# Altium project STPMotorControl_1.PrjPcb (part 1 of 2)
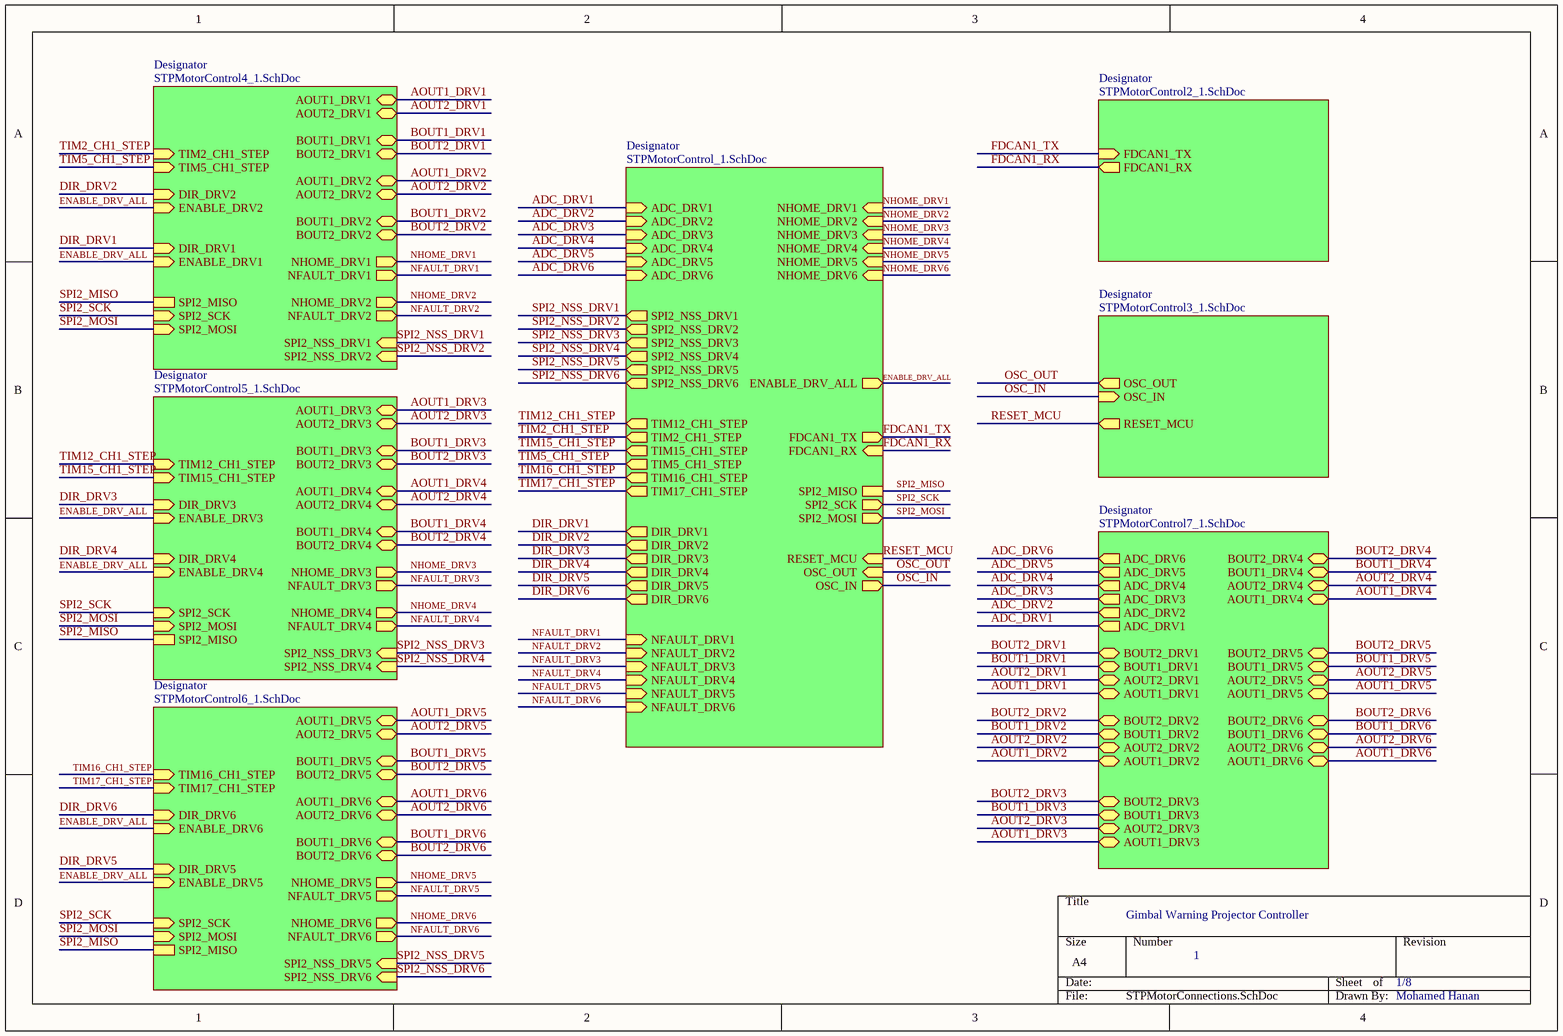
[diagram p0: STPMotorConnections.SchDoc]
8 sheets, 149 parts. Net scope: hierarchical (ports join the sheet entries above them; power ports are global).
Board file: STPMotorControl_1.PcbDoc
Sheets:
  STPMotorConnections.SchDoc
    Designator = STPMotorControl_1.SchDoc
    Designator = STPMotorControl2_1.SchDoc
    Designator = STPMotorControl3_1.SchDoc
    Designator = STPMotorControl4_1.SchDoc
    Designator = STPMotorControl5_1.SchDoc
    Designator = STPMotorControl6_1.SchDoc
    Designator = STPMotorControl7_1.SchDoc

## Sheet STPMotorConnections.SchDoc
size A4; SheetNumber: 1; SheetTotal: 8

### Sub-sheets
Designator = STPMotorControl_1.SchDoc: TIM12_CH1_STEP (out), TIM2_CH1_STEP (out), TIM15_CH1_STEP (out), TIM5_CH1_STEP (out), TIM16_CH1_STEP (out), TIM17_CH1_STEP (out), DIR_DRV1 (out), DIR_DRV2 (out), DIR_DRV3 (out), DIR_DRV4 (out), DIR_DRV5 (out), DIR_DRV6 (out), NFAULT_DRV1 (in), NFAULT_DRV2 (in), NFAULT_DRV3 (in), NFAULT_DRV4 (in), NFAULT_DRV5 (in), NFAULT_DRV6 (in), NHOME_DRV1 (in), NHOME_DRV2 (in), NHOME_DRV3 (in), NHOME_DRV4 (in), NHOME_DRV5 (in), NHOME_DRV6 (in), ENABLE_DRV_ALL (out), FDCAN1_TX (out), FDCAN1_RX (in), SPI2_MISO, SPI2_SCK (out), SPI2_MOSI (out), RESET_MCU (in), OSC_OUT (in), OSC_IN (out), ADC_DRV1 (in), ADC_DRV2 (in), ADC_DRV3 (in), ADC_DRV4 (in), ADC_DRV5 (in), ADC_DRV6 (in), SPI2_NSS_DRV1 (out), SPI2_NSS_DRV2 (out), SPI2_NSS_DRV3 (out), SPI2_NSS_DRV4 (out), SPI2_NSS_DRV5 (out), SPI2_NSS_DRV6 (out)
Designator = STPMotorControl2_1.SchDoc: FDCAN1_TX (in), FDCAN1_RX (out)
Designator = STPMotorControl3_1.SchDoc: OSC_OUT (out), OSC_IN (in), RESET_MCU (out)
Designator = STPMotorControl4_1.SchDoc: AOUT1_DRV1 (bidir), AOUT2_DRV1 (bidir), BOUT1_DRV1 (bidir), BOUT2_DRV1 (bidir), AOUT1_DRV2 (bidir), AOUT2_DRV2 (bidir), BOUT1_DRV2 (bidir), BOUT2_DRV2 (bidir), NHOME_DRV1 (out), NFAULT_DRV1 (out), SPI2_NSS_DRV2 (in), SPI2_MISO, SPI2_SCK (in), SPI2_MOSI (in), NHOME_DRV2 (out), NFAULT_DRV2 (out), DIR_DRV1 (in), ENABLE_DRV1 (in), DIR_DRV2 (in), ENABLE_DRV2 (in), TIM2_CH1_STEP (in), TIM5_CH1_STEP (in), SPI2_NSS_DRV1 (in)
Designator = STPMotorControl5_1.SchDoc: AOUT1_DRV3 (bidir), AOUT2_DRV3 (bidir), BOUT1_DRV3 (bidir), BOUT2_DRV3 (bidir), AOUT1_DRV4 (bidir), AOUT2_DRV4 (bidir), BOUT1_DRV4 (bidir), BOUT2_DRV4 (bidir), NHOME_DRV3 (out), NFAULT_DRV3 (out), NHOME_DRV4 (out), NFAULT_DRV4 (out), SPI2_NSS_DRV4 (in), SPI2_SCK (in), SPI2_MOSI (in), SPI2_MISO, DIR_DRV4 (in), ENABLE_DRV4 (in), TIM12_CH1_STEP (in), TIM15_CH1_STEP (in), DIR_DRV3 (in), ENABLE_DRV3 (in), SPI2_NSS_DRV3 (in)
Designator = STPMotorControl6_1.SchDoc: AOUT1_DRV5 (bidir), AOUT2_DRV5 (bidir), BOUT1_DRV5 (bidir), BOUT2_DRV5 (bidir), AOUT1_DRV6 (bidir), AOUT2_DRV6 (bidir), BOUT1_DRV6 (bidir), BOUT2_DRV6 (bidir), NHOME_DRV5 (out), NFAULT_DRV5 (out), NHOME_DRV6 (out), NFAULT_DRV6 (out), SPI2_NSS_DRV6 (in), SPI2_SCK (in), SPI2_MOSI (in), SPI2_MISO, DIR_DRV5 (in), ENABLE_DRV5 (in), DIR_DRV6 (in), ENABLE_DRV6 (in), TIM16_CH1_STEP (in), TIM17_CH1_STEP (in), SPI2_NSS_DRV5 (in)
Designator = STPMotorControl7_1.SchDoc: ADC_DRV6 (out), ADC_DRV5 (out), ADC_DRV4 (out), ADC_DRV3 (out), ADC_DRV2 (out), ADC_DRV1 (out), BOUT2_DRV1 (bidir), BOUT1_DRV1 (bidir), AOUT2_DRV1 (bidir), AOUT1_DRV1 (bidir), BOUT2_DRV2 (bidir), BOUT1_DRV2 (bidir), AOUT2_DRV2 (bidir), AOUT1_DRV2 (bidir), BOUT2_DRV3 (bidir), BOUT1_DRV3 (bidir), AOUT2_DRV3 (bidir), AOUT1_DRV3 (bidir), BOUT2_DRV4 (bidir), BOUT1_DRV4 (bidir), AOUT2_DRV4 (bidir), AOUT1_DRV4 (bidir), BOUT2_DRV5 (bidir), BOUT1_DRV5 (bidir), AOUT2_DRV5 (bidir), AOUT1_DRV5 (bidir), BOUT2_DRV6 (bidir), BOUT1_DRV6 (bidir), AOUT2_DRV6 (bidir), AOUT1_DRV6 (bidir)

### Nets
ADC_DRV1: sheet Designator/ADC_DRV1, sheet Designator/ADC_DRV1
ADC_DRV2: sheet Designator/ADC_DRV2, sheet Designator/ADC_DRV2
ADC_DRV3: sheet Designator/ADC_DRV3, sheet Designator/ADC_DRV3
ADC_DRV4: sheet Designator/ADC_DRV4, sheet Designator/ADC_DRV4
ADC_DRV5: sheet Designator/ADC_DRV5, sheet Designator/ADC_DRV5
ADC_DRV6: sheet Designator/ADC_DRV6, sheet Designator/ADC_DRV6
AOUT1_DRV1: sheet Designator/AOUT1_DRV1, sheet Designator/AOUT1_DRV1
AOUT1_DRV2: sheet Designator/AOUT1_DRV2, sheet Designator/AOUT1_DRV2
AOUT1_DRV3: sheet Designator/AOUT1_DRV3, sheet Designator/AOUT1_DRV3
AOUT1_DRV4: sheet Designator/AOUT1_DRV4, sheet Designator/AOUT1_DRV4
AOUT1_DRV5: sheet Designator/AOUT1_DRV5, sheet Designator/AOUT1_DRV5
AOUT1_DRV6: sheet Designator/AOUT1_DRV6, sheet Designator/AOUT1_DRV6
AOUT2_DRV1: sheet Designator/AOUT2_DRV1, sheet Designator/AOUT2_DRV1
AOUT2_DRV2: sheet Designator/AOUT2_DRV2, sheet Designator/AOUT2_DRV2
AOUT2_DRV3: sheet Designator/AOUT2_DRV3, sheet Designator/AOUT2_DRV3
AOUT2_DRV4: sheet Designator/AOUT2_DRV4, sheet Designator/AOUT2_DRV4
AOUT2_DRV5: sheet Designator/AOUT2_DRV5, sheet Designator/AOUT2_DRV5
AOUT2_DRV6: sheet Designator/AOUT2_DRV6, sheet Designator/AOUT2_DRV6
BOUT1_DRV1: sheet Designator/BOUT1_DRV1, sheet Designator/BOUT1_DRV1
BOUT1_DRV2: sheet Designator/BOUT1_DRV2, sheet Designator/BOUT1_DRV2
BOUT1_DRV3: sheet Designator/BOUT1_DRV3, sheet Designator/BOUT1_DRV3
BOUT1_DRV4: sheet Designator/BOUT1_DRV4, sheet Designator/BOUT1_DRV4
BOUT1_DRV5: sheet Designator/BOUT1_DRV5, sheet Designator/BOUT1_DRV5
BOUT1_DRV6: sheet Designator/BOUT1_DRV6, sheet Designator/BOUT1_DRV6
BOUT2_DRV1: sheet Designator/BOUT2_DRV1, sheet Designator/BOUT2_DRV1
BOUT2_DRV2: sheet Designator/BOUT2_DRV2, sheet Designator/BOUT2_DRV2
BOUT2_DRV3: sheet Designator/BOUT2_DRV3, sheet Designator/BOUT2_DRV3
BOUT2_DRV4: sheet Designator/BOUT2_DRV4, sheet Designator/BOUT2_DRV4
BOUT2_DRV5: sheet Designator/BOUT2_DRV5, sheet Designator/BOUT2_DRV5
BOUT2_DRV6: sheet Designator/BOUT2_DRV6, sheet Designator/BOUT2_DRV6
DIR_DRV1: sheet Designator/DIR_DRV1, sheet Designator/DIR_DRV1
DIR_DRV2: sheet Designator/DIR_DRV2, sheet Designator/DIR_DRV2
DIR_DRV3: sheet Designator/DIR_DRV3, sheet Designator/DIR_DRV3
DIR_DRV4: sheet Designator/DIR_DRV4, sheet Designator/DIR_DRV4
DIR_DRV5: sheet Designator/DIR_DRV5, sheet Designator/DIR_DRV5
DIR_DRV6: sheet Designator/DIR_DRV6, sheet Designator/DIR_DRV6
ENABLE_DRV_ALL: sheet Designator/ENABLE_DRV_ALL, sheet Designator/ENABLE_DRV1, sheet Designator/ENABLE_DRV2, sheet Designator/ENABLE_DRV4, sheet Designator/ENABLE_DRV3, sheet Designator/ENABLE_DRV5, sheet Designator/ENABLE_DRV6
FDCAN1_RX: sheet Designator/FDCAN1_RX, sheet Designator/FDCAN1_RX
FDCAN1_TX: sheet Designator/FDCAN1_TX, sheet Designator/FDCAN1_TX
NFAULT_DRV1: sheet Designator/NFAULT_DRV1, sheet Designator/NFAULT_DRV1
NFAULT_DRV2: sheet Designator/NFAULT_DRV2, sheet Designator/NFAULT_DRV2
NFAULT_DRV3: sheet Designator/NFAULT_DRV3, sheet Designator/NFAULT_DRV3
NFAULT_DRV4: sheet Designator/NFAULT_DRV4, sheet Designator/NFAULT_DRV4
NFAULT_DRV5: sheet Designator/NFAULT_DRV5, sheet Designator/NFAULT_DRV5
NFAULT_DRV6: sheet Designator/NFAULT_DRV6, sheet Designator/NFAULT_DRV6
NHOME_DRV1: sheet Designator/NHOME_DRV1, sheet Designator/NHOME_DRV1
NHOME_DRV2: sheet Designator/NHOME_DRV2, sheet Designator/NHOME_DRV2
NHOME_DRV3: sheet Designator/NHOME_DRV3, sheet Designator/NHOME_DRV3
NHOME_DRV4: sheet Designator/NHOME_DRV4, sheet Designator/NHOME_DRV4
NHOME_DRV5: sheet Designator/NHOME_DRV5, sheet Designator/NHOME_DRV5
NHOME_DRV6: sheet Designator/NHOME_DRV6, sheet Designator/NHOME_DRV6
OSC_IN: sheet Designator/OSC_IN, sheet Designator/OSC_IN
OSC_OUT: sheet Designator/OSC_OUT, sheet Designator/OSC_OUT
RESET_MCU: sheet Designator/RESET_MCU, sheet Designator/RESET_MCU  [project net RESET]
SPI2_MISO: sheet Designator/SPI2_MISO, sheet Designator/SPI2_MISO, sheet Designator/SPI2_MISO, sheet Designator/SPI2_MISO
SPI2_MOSI: sheet Designator/SPI2_MOSI, sheet Designator/SPI2_MOSI, sheet Designator/SPI2_MOSI, sheet Designator/SPI2_MOSI
SPI2_NSS_DRV1: sheet Designator/SPI2_NSS_DRV1, sheet Designator/SPI2_NSS_DRV1
SPI2_NSS_DRV2: sheet Designator/SPI2_NSS_DRV2, sheet Designator/SPI2_NSS_DRV2
SPI2_NSS_DRV3: sheet Designator/SPI2_NSS_DRV3, sheet Designator/SPI2_NSS_DRV3
SPI2_NSS_DRV4: sheet Designator/SPI2_NSS_DRV4, sheet Designator/SPI2_NSS_DRV4
SPI2_NSS_DRV5: sheet Designator/SPI2_NSS_DRV5, sheet Designator/SPI2_NSS_DRV5
SPI2_NSS_DRV6: sheet Designator/SPI2_NSS_DRV6, sheet Designator/SPI2_NSS_DRV6
SPI2_SCK: sheet Designator/SPI2_SCK, sheet Designator/SPI2_SCK, sheet Designator/SPI2_SCK, sheet Designator/SPI2_SCK
TIM2_CH1_STEP: sheet Designator/TIM2_CH1_STEP, sheet Designator/TIM2_CH1_STEP
TIM5_CH1_STEP: sheet Designator/TIM5_CH1_STEP, sheet Designator/TIM5_CH1_STEP
TIM12_CH1_STEP: sheet Designator/TIM12_CH1_STEP, sheet Designator/TIM12_CH1_STEP
TIM15_CH1_STEP: sheet Designator/TIM15_CH1_STEP, sheet Designator/TIM15_CH1_STEP
TIM16_CH1_STEP: sheet Designator/TIM16_CH1_STEP, sheet Designator/TIM16_CH1_STEP
TIM17_CH1_STEP: sheet Designator/TIM17_CH1_STEP, sheet Designator/TIM17_CH1_STEP

### Notes on the sheet
- Gimbal Warning Projector Controller
- 1
- 1/8
- Mohamed Hanan

## Sheet STPMotorControl_1.SchDoc
size A4; SheetNumber: 2; SheetTotal: 8
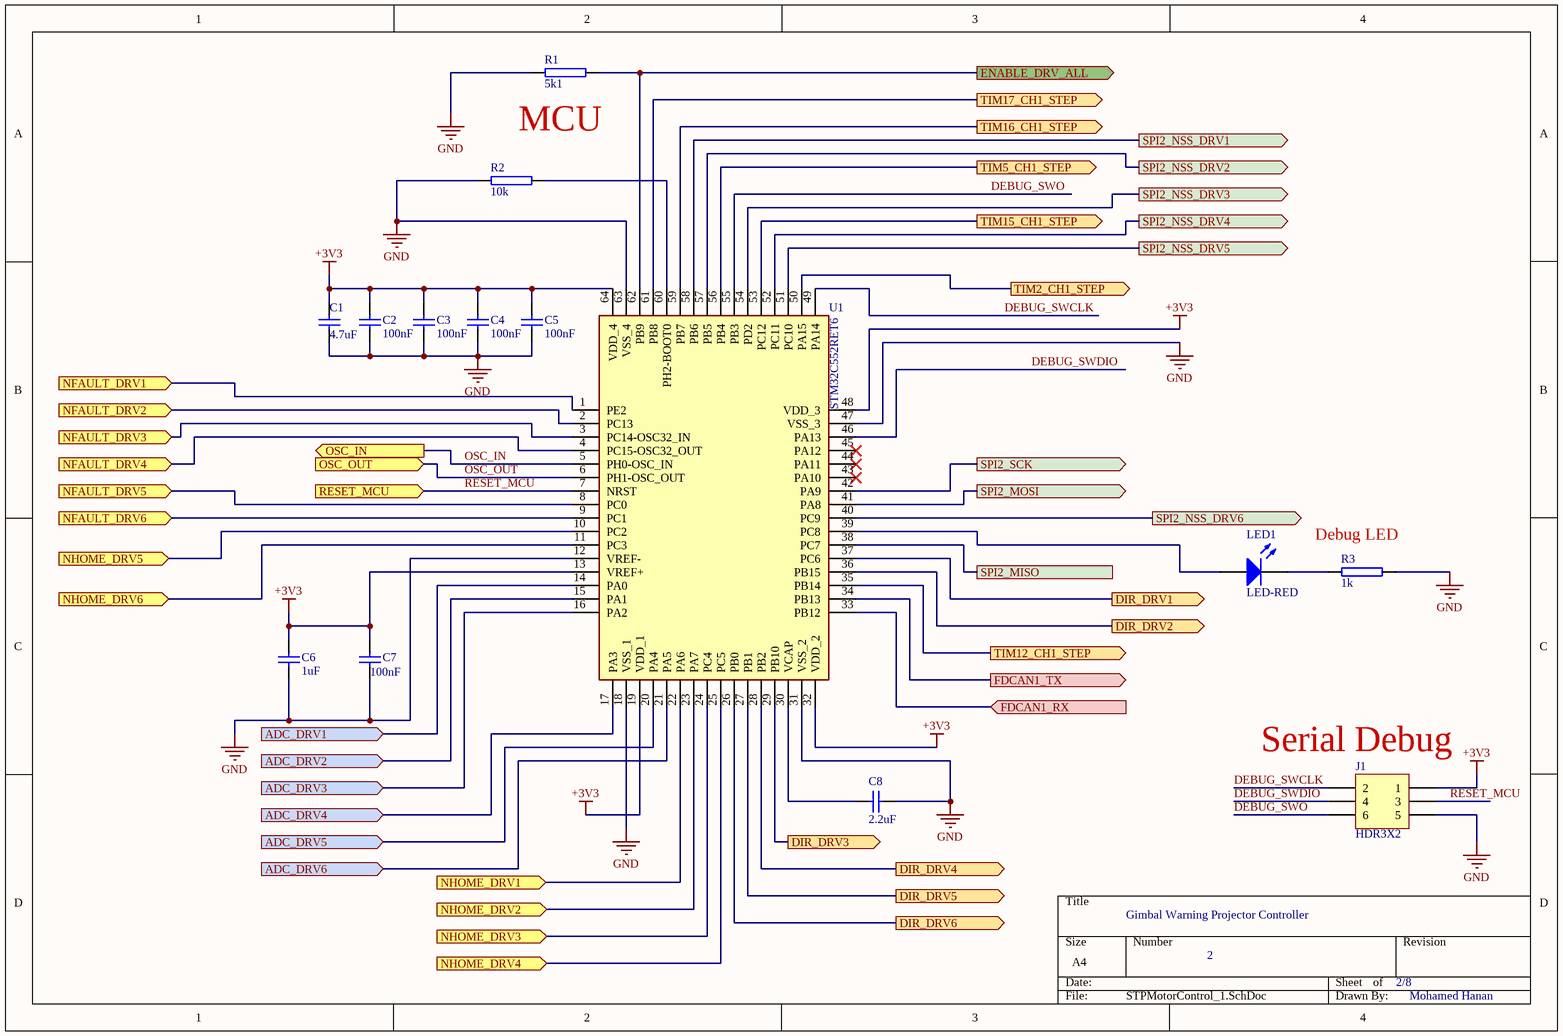
[diagram p1: STPMotorControl_1.SchDoc]

### Parts
C1  4.7uF  [CAP_1206]
C2  100nF  [CAP_0805]
C3  100nF  [CAP_0805]
C4  100nF  [CAP_0805]
C5  100nF  [CAP_0805]
C6  1uF  [CAP_0805]
C7  100nF  [CAP_0805]
C8  2.2uF  [CAP_0805]
J1  HDR3X2  [HDR2X3_AUT]
LED1  LED-RED  [LED1206R]
R1  5k1  [RES_0805]
R2  10k  [RES_0805]
R3  1k  [RES_1206]
U1  STM32C552RET6  [LQFP40P900X900X145-64N]

### Ports
ADC_DRV1 (in, see STPMotorConnections[2A], STPMotorControl7_1[2D]), ADC_DRV2 (in, see STPMotorConnections[2A], STPMotorControl7_1[2C]), ADC_DRV3 (in, see STPMotorConnections[2A], STPMotorControl7_1[2C]), ADC_DRV4 (in, see STPMotorConnections[2A], STPMotorControl7_1[2B]), ADC_DRV5 (in, see STPMotorConnections[2B], STPMotorControl7_1[2B]), ADC_DRV6 (in, see STPMotorConnections[2B], STPMotorControl7_1[2A]), DIR_DRV1 (out, see STPMotorConnections[2C], STPMotorControl4_1[2C]), DIR_DRV2 (out, see STPMotorConnections[2C], STPMotorControl4_1[4A]), DIR_DRV3 (out, see STPMotorConnections[2C], STPMotorControl5_1[2C]), DIR_DRV4 (out, see STPMotorConnections[2C], STPMotorControl5_1[4A]), DIR_DRV5 (out, see STPMotorConnections[2C], STPMotorControl6_1[2C]), DIR_DRV6 (out, see STPMotorConnections[2C], STPMotorControl6_1[4A]), ENABLE_DRV_ALL (out, see STPMotorConnections[3B]), FDCAN1_RX (in, see STPMotorConnections[3B], STPMotorControl2_1[1B]), FDCAN1_TX (out, see STPMotorConnections[3B], STPMotorControl2_1[1B]), NFAULT_DRV1 (in, see STPMotorConnections[2C], STPMotorControl4_1[2D]), NFAULT_DRV2 (in, see STPMotorConnections[2C], STPMotorControl4_1[4B]), NFAULT_DRV3 (in, see STPMotorConnections[2C], STPMotorControl5_1[2D]), NFAULT_DRV4 (in, see STPMotorConnections[2C], STPMotorControl5_1[4B]), NFAULT_DRV5 (in, see STPMotorConnections[2C], STPMotorControl6_1[2D]), NFAULT_DRV6 (in, see STPMotorConnections[2C], STPMotorControl6_1[4B]), NHOME_DRV1 (in, see STPMotorConnections[3A], STPMotorControl4_1[2C]), NHOME_DRV2 (in, see STPMotorConnections[3A], STPMotorControl4_1[4B]), NHOME_DRV3 (in, see STPMotorConnections[3A], STPMotorControl5_1[2C]), NHOME_DRV4 (in, see STPMotorConnections[3A], STPMotorControl5_1[4B]), NHOME_DRV5 (in, see STPMotorConnections[3B], STPMotorControl6_1[2C]), NHOME_DRV6 (in, see STPMotorConnections[3B], STPMotorControl6_1[4B]), OSC_IN (out, see STPMotorConnections[3C], STPMotorControl3_1[2C]), OSC_OUT (in, see STPMotorConnections[3C], STPMotorControl3_1[2C]), RESET_MCU (in, see STPMotorConnections[3C], STPMotorControl3_1[3C]), SPI2_MISO (see STPMotorConnections[3B], STPMotorControl4_1[4C], STPMotorControl5_1[4C], STPMotorControl6_1[4C]), SPI2_MOSI (out, see STPMotorConnections[3C], STPMotorControl4_1[4C], STPMotorControl5_1[4C], STPMotorControl6_1[4C]), SPI2_NSS_DRV1 (out, see STPMotorConnections[2B], STPMotorControl4_1[2C]), SPI2_NSS_DRV2 (out, see STPMotorConnections[2B], STPMotorControl4_1[4B]), SPI2_NSS_DRV3 (out, see STPMotorConnections[2B], STPMotorControl5_1[2C]), SPI2_NSS_DRV4 (out, see STPMotorConnections[2B], STPMotorControl5_1[4B]), SPI2_NSS_DRV5 (out, see STPMotorConnections[2B], STPMotorControl6_1[2C]), SPI2_NSS_DRV6 (out, see STPMotorConnections[2B], STPMotorControl6_1[4B]), SPI2_SCK (out, see STPMotorConnections[3B], STPMotorControl4_1[4C], STPMotorControl5_1[4C], STPMotorControl6_1[4C]), TIM2_CH1_STEP (out, see STPMotorConnections[2B], STPMotorControl4_1[3C]), TIM5_CH1_STEP (out, see STPMotorConnections[2B], STPMotorControl4_1[4A]), TIM12_CH1_STEP (out, see STPMotorConnections[2B], STPMotorControl5_1[2C]), TIM15_CH1_STEP (out, see STPMotorConnections[2B], STPMotorControl5_1[4A]), TIM16_CH1_STEP (out, see STPMotorConnections[2B], STPMotorControl6_1[2C]), TIM17_CH1_STEP (out, see STPMotorConnections[2B], STPMotorControl6_1[4A])

### Nets
+3V3: C1.2 C2.2 C3.2 C4.2 C5.2 C6.2 C7.2 J1.1 U1.13(VREF+) U1.19(VDD_1) U1.32(VDD_2) U1.48(VDD_3) U1.64(VDD_4)
GND: C1.1 C2.1 C3.1 C4.1 C5.1 C6.1 C7.1 C8.2 J1.5 R1.1 R2.1 R3.2 U1.12(VREF-) U1.18(VSS_1) U1.31(VSS_2) U1.47(VSS_3) U1.63(VSS_4)
ADC_DRV1: U1.14(PA0) ; port ADC_DRV1
ADC_DRV2: U1.15(PA1) ; port ADC_DRV2
ADC_DRV3: U1.16(PA2) ; port ADC_DRV3
ADC_DRV4: U1.17(PA3) ; port ADC_DRV4
ADC_DRV5: U1.20(PA4) ; port ADC_DRV5
ADC_DRV6: U1.21(PA5) ; port ADC_DRV6
DEBUG_SWCLK: J1.2 U1.49(PA14)
DEBUG_SWDIO: J1.4 U1.46(PA13)
DEBUG_SWO: J1.6 U1.55(PB3)
DIR_DRV1: U1.37(PC6) ; port DIR_DRV1
DIR_DRV2: U1.36(PB15) ; port DIR_DRV2
DIR_DRV3: U1.29(PB10) ; port DIR_DRV3
DIR_DRV4: U1.28(PB2) ; port DIR_DRV4
DIR_DRV5: U1.27(PB1) ; port DIR_DRV5
DIR_DRV6: U1.26(PB0) ; port DIR_DRV6
ENABLE_DRV_ALL: R1.2 U1.62(PB9) ; port ENABLE_DRV_ALL
FDCAN1_RX: U1.33(PB12) ; port FDCAN1_RX
FDCAN1_TX: U1.34(PB13) ; port FDCAN1_TX
NFAULT_DRV1: U1.1(PE2) ; port NFAULT_DRV1
NFAULT_DRV2: U1.2(PC13) ; port NFAULT_DRV2
NFAULT_DRV3: U1.3(PC14-OSC32_IN) ; port NFAULT_DRV3
NFAULT_DRV4: U1.4(PC15-OSC32_OUT) ; port NFAULT_DRV4
NFAULT_DRV5: U1.8(PC0) ; port NFAULT_DRV5
NFAULT_DRV6: U1.9(PC1) ; port NFAULT_DRV6
NHOME_DRV1: U1.22(PA6) ; port NHOME_DRV1
NHOME_DRV2: U1.23(PA7) ; port NHOME_DRV2
NHOME_DRV3: U1.24(PC4) ; port NHOME_DRV3
NHOME_DRV4: U1.25(PC5) ; port NHOME_DRV4
NHOME_DRV5: U1.10(PC2) ; port NHOME_DRV5
NHOME_DRV6: U1.11(PC3) ; port NHOME_DRV6
OSC_IN: U1.5(PH0-OSC_IN) ; port OSC_IN
OSC_OUT: U1.6(PH1-OSC_OUT) ; port OSC_OUT
RESET_MCU: J1.3 U1.7(NRST) ; port RESET_MCU  [project net RESET]
SPI2_MISO: U1.38(PC7) ; port SPI2_MISO
SPI2_MOSI: U1.41(PA8) ; port SPI2_MOSI
SPI2_NSS_DRV1: U1.58(PB6) ; port SPI2_NSS_DRV1
SPI2_NSS_DRV2: U1.57(PB5) ; port SPI2_NSS_DRV2
SPI2_NSS_DRV3: U1.54(PD2) ; port SPI2_NSS_DRV3
SPI2_NSS_DRV4: U1.52(PC11) ; port SPI2_NSS_DRV4
SPI2_NSS_DRV5: U1.51(PC10) ; port SPI2_NSS_DRV5
SPI2_NSS_DRV6: U1.40(PC9) ; port SPI2_NSS_DRV6
SPI2_SCK: U1.42(PA9) ; port SPI2_SCK
TIM2_CH1_STEP: U1.50(PA15) ; port TIM2_CH1_STEP
TIM5_CH1_STEP: U1.56(PB4) ; port TIM5_CH1_STEP
TIM12_CH1_STEP: U1.35(PB14) ; port TIM12_CH1_STEP
TIM15_CH1_STEP: U1.53(PC12) ; port TIM15_CH1_STEP
TIM16_CH1_STEP: U1.59(PB7) ; port TIM16_CH1_STEP
TIM17_CH1_STEP: U1.61(PB8) ; port TIM17_CH1_STEP
NetC8_1: C8.1 U1.30(VCAP)
NetLED1_A: LED1.A U1.39(PC8)
NetLED1_K: LED1.K R3.1
NetR2_2: R2.2 U1.60(PH2-BOOT0)

Not connected (* = marked no-connect by the designer): U1 43(PA10)* 44(PA11)* 45(PA12)*

### Notes on the sheet
- MCU
- (near R3) Debug LED
- (near J1) Serial Debug
- Gimbal Warning Projector Controller
- 2
- 2/8
- Mohamed Hanan

### Library data of the parts
C1 = CAPN 1206: Non Polarized Capacitor, SMD, 1206
C2-C8 = CAPN 0805: Non Polarized Capacitor, SMD, 0805
J1 = HDR3X2: Header, 3-Pin, Dual row, 2.54mm Pitch, Straight; Supplier 1: Farnell; Supplier Part Number 1: 9733574
LED1 = SMD 1206 LED-RED: RED LED, Case 1206; Supplier 1: Farnell; Supplier Part Number 1: 8530017
R1 R2 = Resistor 0805: Resistor, SMD, 0805
R3 = Resistor 1206: Resistor, SMD, 1206
U1 = STM32C552RET6: Integrated Circuit; Manufacturer_Name: STMicroelectronics; Datasheet Link: https://www.st.com/resource/en/datasheet/stm32c551cc.pdf; Height: 1.6mm; Manufacturer_Part_Number: STM32C552RET6

## Sheet STPMotorControl2_1.SchDoc
size A4; SheetNumber: 3; SheetTotal: 8
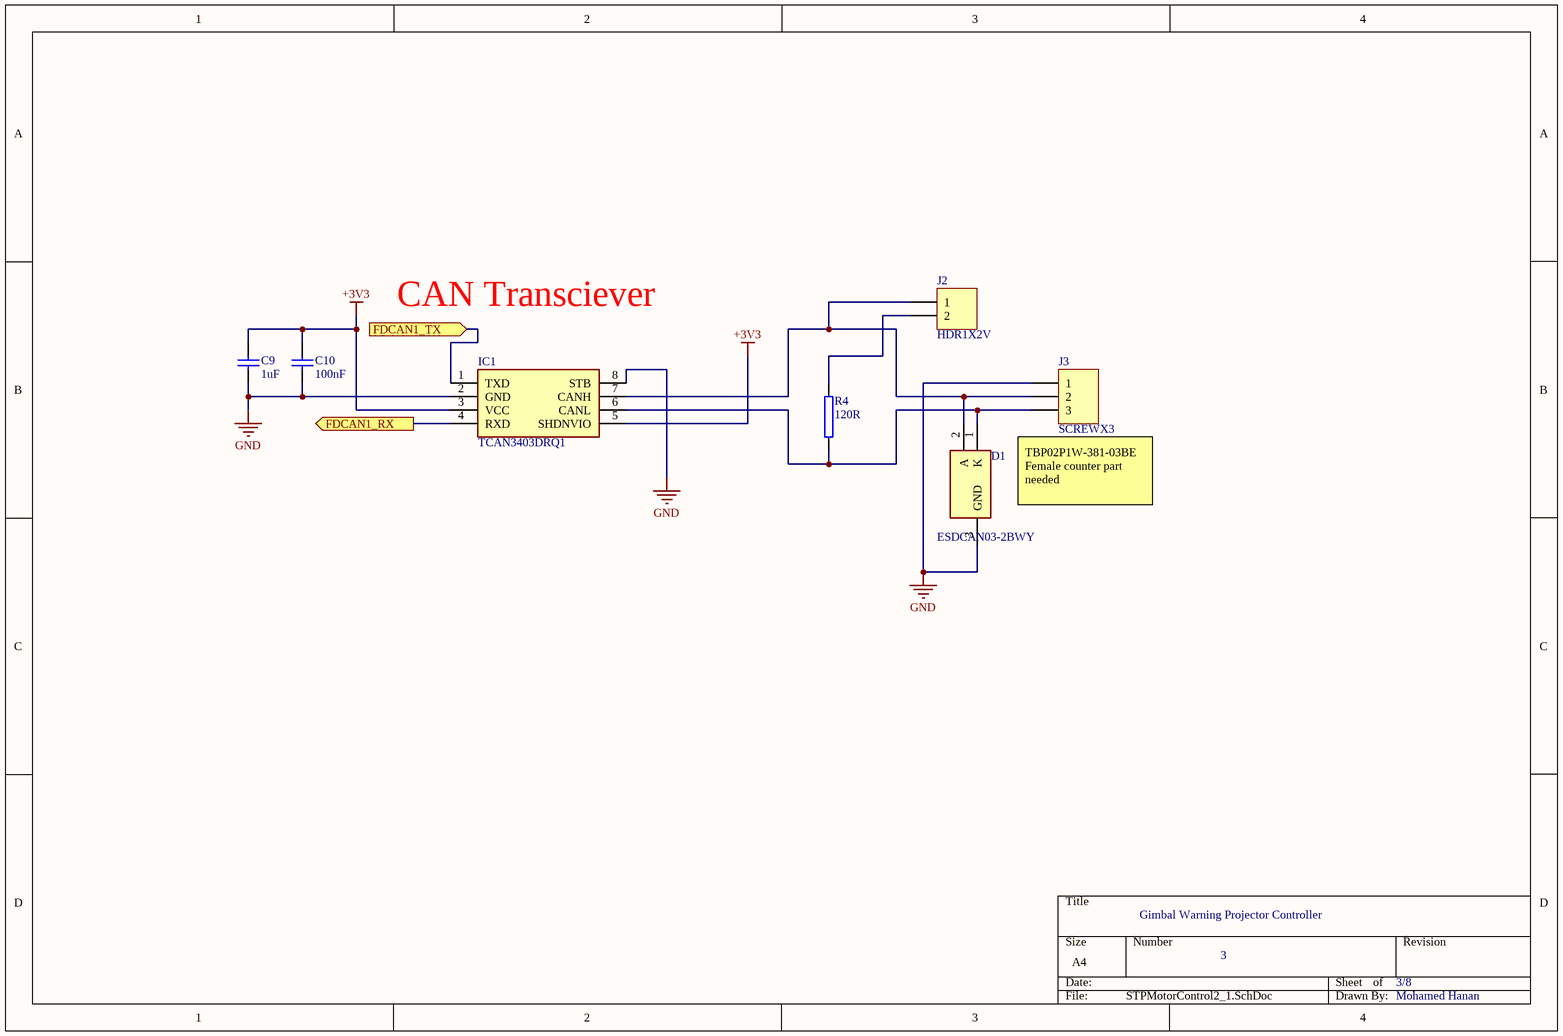
[diagram p2: STPMotorControl2_1.SchDoc]

### Parts
C9  1uF  [CAP_0805]
C10  100nF  [CAP_0805]
D1  ESDCAN03-2BWY  [SOT65P210X110-3N]
IC1  TCAN3403DRQ1  [SOIC127P600X175-8N]
J2  HDR1X2V  [HDR1X2_AUT]
J3  SCREWX3  [SCREW3_AUT]
R4  120R  [RES_1206]

### Ports
FDCAN1_RX (out, see STPMotorConnections[3A], STPMotorControl_1[3C]), FDCAN1_TX (in, see STPMotorConnections[3A], STPMotorControl_1[3C])

### Nets
+3V3: C9.2 C10.2 IC1.3(VCC) IC1.5(SHDNVIO)
GND: C9.1 C10.1 D1.3(GND) IC1.2(GND) IC1.8(STB) J3.1
FDCAN1_RX: IC1.4(RXD) ; port FDCAN1_RX
FDCAN1_TX: IC1.1(TXD) ; port FDCAN1_TX
NetD1_1: D1.1(K) IC1.6(CANL) J3.3 R4.1
NetD1_2: D1.2(A) IC1.7(CANH) J2.1 J3.2
NetJ2_2: J2.2 R4.2

### Notes on the sheet
- CAN Transciever
- TBP02P1W-381-03BE
  Female counter part needed
- Gimbal Warning Projector Controller
- 3
- 3/8
- Mohamed Hanan

### Library data of the parts
C9 C10 = CAPN 0805: Non Polarized Capacitor, SMD, 0805
D1 = ESDCAN03-2BWY: TVS Diode (Uni-directional); Manufacturer_Name: STMicroelectronics; Datasheet Link: https://www.st.com/resource/en/datasheet/esdcan03-2bwy.pdf; Height: 1.1mm; Manufacturer_Part_Number: ESDCAN03-2BWY; Mouser Part Number: 511-ESDCAN03-2BWY; Mouser Price/Stock: https://www.mouser.co.uk/ProductDetail/STMicroelectronics/ESDCAN03-2BWY?qs=FqY30PPN9V2iiokjuqa22Q%3D%3D; Arrow Part Number: ESDCAN03-2BWY; Arrow Price/Stock: https://www.arrow.com/en/products/esdcan03-2bwy/stmicroelectronics.html?utm_currency=USD&region=europe
IC1 = TCAN3403DRQ1: Integrated Circuit; Manufacturer_Name: Texas Instruments; Datasheet Link: https://www.ti.com/lit/ds/symlink/tcan3403-q1.pdf?ts=1732780388772&ref_url=https%253A%252F%252Fwww.ti.com%252Fproduct%252FTCAN3403-Q1%252Fpart-details%252FTCAN3403DRQ1; Height: 1.75mm; Manufacturer_Part_Number: TCAN3403DRQ1; Mouser Part Number: 595-TCAN3403DRQ1; Mouser Price/Stock: https://www.mouser.co.uk/ProductDetail/Texas-Instruments/TCAN3403DRQ1?qs=VVKQmw408U8i3BeOClYB9g%3D%3D; Arrow Part Number: TCAN3403DRQ1; Arrow Price/Stock: https://www.arrow.com/en/products/tcan3403drq1/texas-instruments?utm_currency=USD&region=nac
J2 = HDR1X2V: Header, Plug, 2.54mm, 2 Pins, Straight; Supplier 1: Farnell; Supplier Part Number 1: 2254030
J3 = SCREWX3: Terminal Block, PCB, 3Way, Pitch 5mm; Supplier 1: Farnell; Supplier Part Number 1: 9632689
R4 = Resistor 1206: Resistor, SMD, 1206

## Sheet STPMotorControl3_1.SchDoc
size A4; SheetNumber: 4; SheetTotal: 8
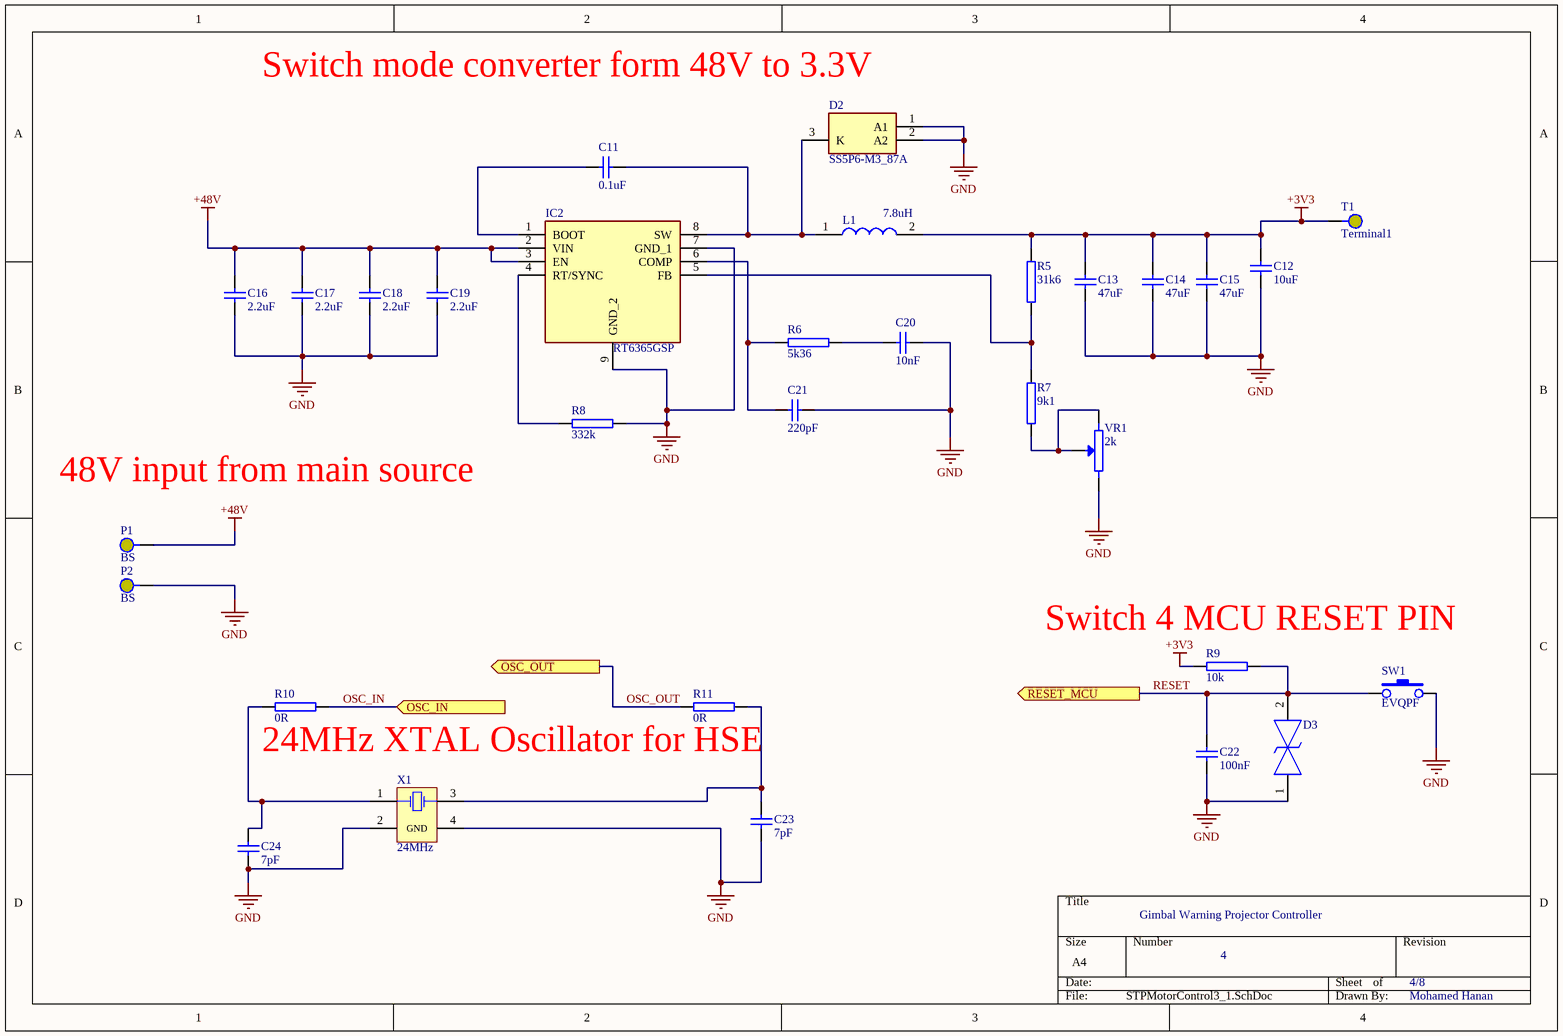
[diagram p3: STPMotorControl3_1.SchDoc]

### Parts
C11  0.1uF  [CAP_1206]
C12  10uF  [CAP_1206]
C13  47uF  [CAP_1206]
C14  47uF  [CAP_1206]
C15  47uF  [CAP_1206]
C16  2.2uF  [CAP_0805]
C17  2.2uF  [CAP_0805]
C18  2.2uF  [CAP_0805]
C19  2.2uF  [CAP_0805]
C20  10nF  [CAP_0805]
C21  220pF  [CAP_1206]
C22  100nF  [CAP_0805]
C23  7pF  [CAP_0805]
C24  7pF  [CAP_0805]
D2  SS5P6-M3_87A  [SS5P6M387A]
D3  TSD05CDYFR  [SOD2613X100N]  (value not drawn)
IC2  RT6365GSP  [SOIC127P600X175-9N]
L1  7.8uH  [WE-HCI_103023]
P1  BS  [Banana_AUT]
P2  BS  [Banana_AUT]
R5  31k6  [RES_0805]
R6  5k36  [RES_0805]
R7  9k1  [RES_0805]
R8  332k  [RES_0805]
R9  10k  [RES_0805]
R10  0R  [RES_0805]
R11  0R  [RES_0805]
SW1  EVQPF  [EVQPF203M]
T1  Terminal1  [PAD1_AUT]
VR1  2k  [3362S]
X1  24MHz  [CX2520SB]

### Ports
OSC_IN (in, see STPMotorConnections[3B], STPMotorControl_1[1B]), OSC_OUT (out, see STPMotorConnections[3B], STPMotorControl_1[1B]), RESET_MCU (out, see STPMotorConnections[3B], STPMotorControl_1[1B])

### Nets
+3V3: C12.2 C13.2 C14.2 C15.2 L1.2 R5.2 R9.2 T1.1
+48V: C16.2 C17.2 C18.2 C19.2 IC2.2(VIN) IC2.3(EN) P1.1
GND: C12.1 C13.1 C14.1 C15.1 C16.1 C17.1 C18.1 C19.1 C20.2 C21.2 C22.1 C23.2 C24.2 D2.1(A1) D2.2(A2) D3.1 IC2.7(GND_1) IC2.9(GND_2) P2.1 R8.2 SW1.2 VR1.2(BOT) X1.2(GND) X1.4(GND)
OSC_IN: R10.2 ; port OSC_IN
OSC_OUT: R11.1 ; port OSC_OUT
RESET: C22.2 D3.2 R9.1 SW1.1 ; port RESET_MCU
NetC11_1: C11.1 IC2.1(BOOT)
NetC11_2: C11.2 D2.3(K) IC2.8(SW) L1.1
NetC20_1: C20.1 R6.2
NetC21_1: C21.1 IC2.6(COMP) R6.1
NetC23_1: C23.1 R11.2 X1.3(OSC2)
NetC24_1: C24.1 R10.1 X1.1(OSC1)
NetIC2_4: IC2.4(RT/SYNC) R8.1
NetIC2_5: IC2.5(FB) R5.1 R7.2
NetR7_1: R7.1 VR1.1(TOP) VR1.W(TAP)

### Notes on the sheet
- (near D2) Switch mode converter form 48V to 3.3V
- 48V input from main source
- (near R9) Switch 4 MCU RESET PIN
- 24MHz XTAL Oscillator for HSE
- Gimbal Warning Projector Controller
- 4
- 4/8
- Mohamed Hanan

### Library data of the parts
C11-C15 C21 = CAPN 1206: Non Polarized Capacitor, SMD, 1206
C16-C20 C22-C24 = CAPN 0805: Non Polarized Capacitor, SMD, 0805
D2 = SS5P6-M3_87A: Schottky Diode; Manufacturer_Name: Vishay; Manufacturer_Part_Number: SS5P6-M3/87A; Datasheet Link: https://www.vishay.com/docs/88988/ss5p6.pdf; Height: 1.2mm; Mouser Part Number: 625-SS5P6-M3/87A; Mouser Price/Stock: https://www.mouser.co.uk/ProductDetail/Vishay-General-Semiconductor/SS5P6-M3-87A?qs=XGzIaZb%2FFYLx0h%2FWoI%2FVUQ%3D%3D; Arrow Part Number: SS5P6-M3/87A; Arrow Price/Stock: https://www.arrow.com/en/products/ss5p6-m387a/vishay?utm_currency=USD&region=nac
D3 = TSD05CDYFR: TVS Diode (Bi-directional); Manufacturer_Name: Texas Instruments; Datasheet Link: https://www.ti.com/lit/ds/symlink/tsd05c.pdf?ts=1691730725852&ref_url=https%253A%252F%252Fwww.ti.com%252Fproduct%252FTSD05C%253FkeyMatch%253DTSD05CDYFR%2526tisearch%253Dsearch-everything%2526usecase%253DOPN; Height: 1mm; Manufacturer_Part_Number: TSD05CDYFR; Mouser Part Number: 595-TSD05CDYFR; Mouser Price/Stock: https://www.mouser.co.uk/ProductDetail/Texas-Instruments/TSD05CDYFR?qs=Imq1NPwxi74wAiGFX0POZQ%3D%3D; Arrow Part Number: TSD05CDYFR; Arrow Price/Stock: https://www.arrow.com/en/products/tsd05cdyfr/texas-instruments.html?utm_currency=USD&region=nac
IC2 = RT6365GSP: Integrated Circuit; Manufacturer_Name: RICHTEK; Datasheet Link: https://www.richtek.com/assets/product_file/RT6365/DS6365-02.pdf; Height: 1.753mm; Manufacturer_Part_Number: RT6365GSP; Mouser Part Number: 835-RT6365GSP; Mouser Price/Stock: https://www.mouser.co.uk/ProductDetail/Richtek/RT6365GSP?qs=amGC7iS6iy%252BGHkAL3RFUug%3D%3D
L1 = 744325780: Inductor; Manufacturer_Name: Wurth Elektronik; Datasheet Link: https://www.we-online.com/catalog/datasheet/744325780.pdf; Height: 4.7mm; Manufacturer_Part_Number: 744325780; Mouser Part Number: 710-744325780; Mouser Price/Stock: https://www.mouser.co.uk/ProductDetail/Wurth-Elektronik/744325780?qs=VxkwJfKV0FQ2%2FeCS8beGcw%3D%3D
P1 P2 = Banana Socket: Banana Socket, 4mm, Panel, Black, 10A; Supplier 1: Farnell; Supplier Part Number 1: 1101113
R5-R11 = Resistor 0805: Resistor, SMD, 0805
SW1 = EVQPF: PANASONIC  EVQPF203M  SWITCH, TACTILE, SPST-NO, 20mA, 15VDC; Supplier 1: Farnell; Supplier Part Number 1: 2079505
T1 = Terminal1: Terminal, Pad 70x70mil, Hole 32 mil
VR1 = 3362S-1-202LF: 3362S Series, 1/4 ” Square  Potentiometer, 2k, 10%, 0.5 Watts, 1Turn; Supplier 1: Farnell; Supplier Part Number 1: 2321842
X1 = CX2520SB24000D0FLJZZ: Crystals, 24MHz; Supplier 1: Farnell; Supplier Part Number 1: 1657889

## Sheet STPMotorControl4_1.SchDoc
size A4; SheetNumber: 5; SheetTotal: 8
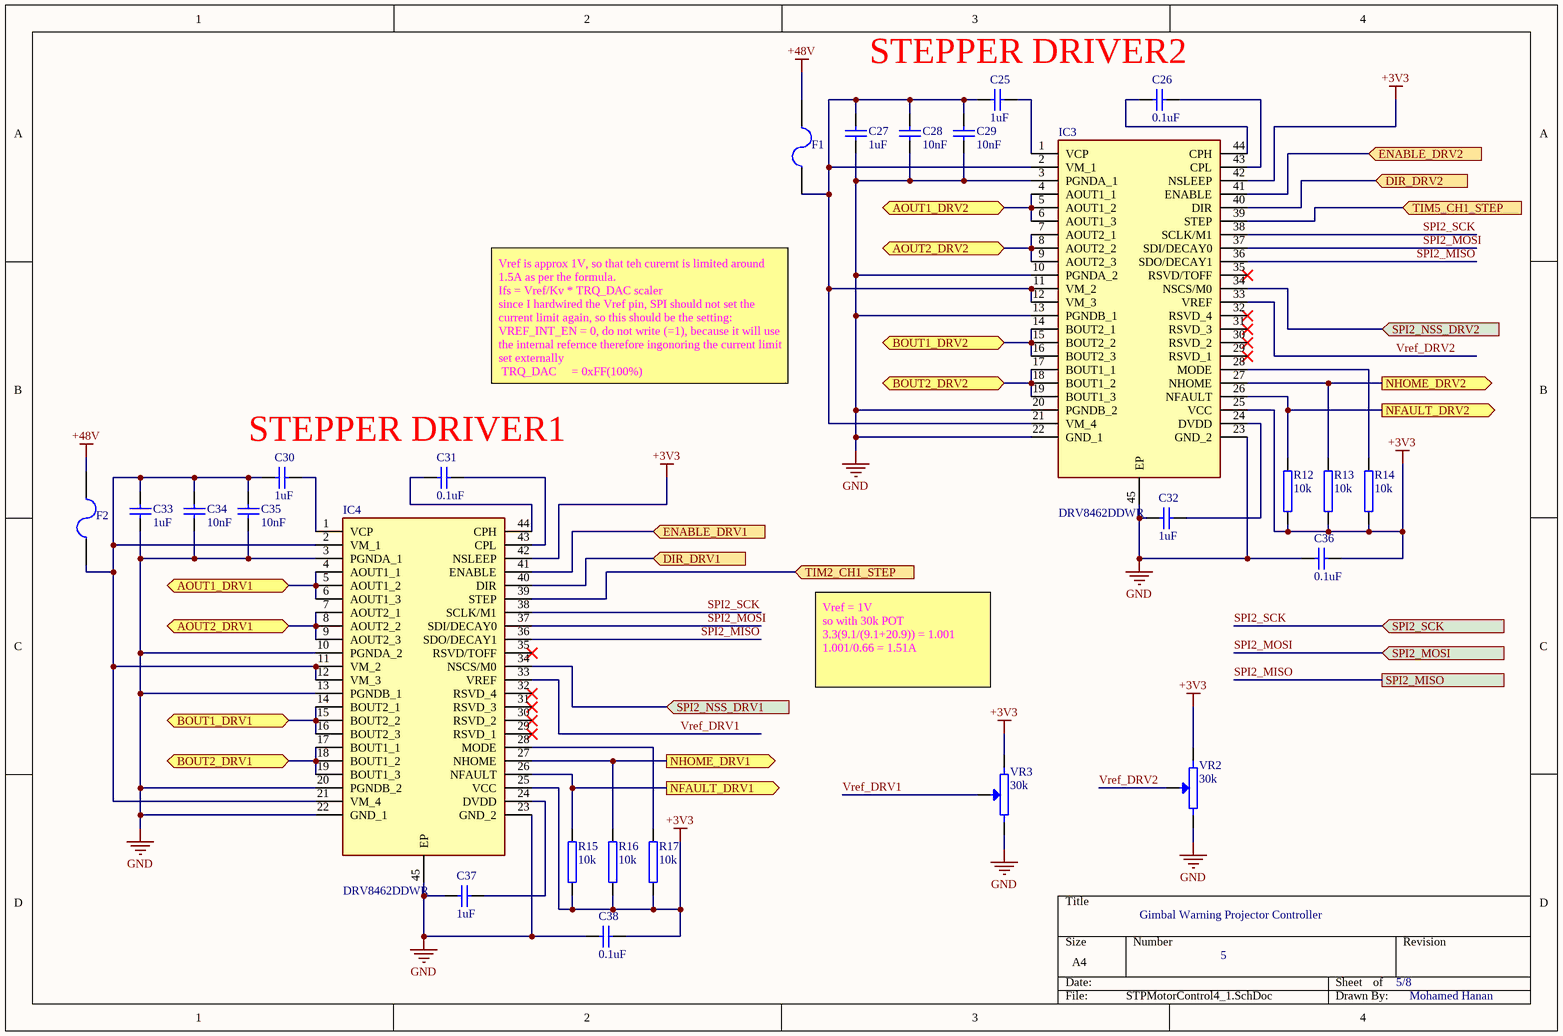
[diagram p4: STPMotorControl4_1.SchDoc]

### Parts
C25  1uF  [CAP_0805]
C26  0.1uF  [CAP_1206]
C27  1uF  [CAP_0805]
C28  10nF  [CAP_0805]
C29  10nF  [CAP_0805]
C30  1uF  [CAP_0805]
C31  0.1uF  [CAP_1206]
C32  1uF  [CAP_0805]
C33  1uF  [CAP_0805]
C34  10nF  [CAP_0805]
C35  10nF  [CAP_0805]
C36  0.1uF  [CAP_1206]
C37  1uF  [CAP_0805]
C38  0.1uF  [CAP_1206]
F1  1206L035/16YR  [MC36207]  (value not drawn)
F2  1206L035/16YR  [MC36207]  (value not drawn)
IC3  DRV8462DDWR  [SOP64P810X120-45N]
IC4  DRV8462DDWR  [SOP64P810X120-45N]
R12  10k  [RES_0805]
R13  10k  [RES_0805]
R14  10k  [RES_0805]
R15  10k  [RES_0805]
R16  10k  [RES_0805]
R17  10k  [RES_0805]
VR2  30k  [3362S]
VR3  30k  [3362S]

### Ports
AOUT1_DRV1 (bidir, see STPMotorConnections[2A], STPMotorControl7_1[1A]), AOUT1_DRV2 (bidir, see STPMotorConnections[2A], STPMotorControl7_1[1B]), AOUT2_DRV1 (bidir, see STPMotorConnections[2A], STPMotorControl7_1[1A]), AOUT2_DRV2 (bidir, see STPMotorConnections[2A], STPMotorControl7_1[1B]), BOUT1_DRV1 (bidir, see STPMotorConnections[2A], STPMotorControl7_1[1A]), BOUT1_DRV2 (bidir, see STPMotorConnections[2A], STPMotorControl7_1[1B]), BOUT2_DRV1 (bidir, see STPMotorConnections[2A], STPMotorControl7_1[1A]), BOUT2_DRV2 (bidir, see STPMotorConnections[2A], STPMotorControl7_1[1B]), DIR_DRV1 (in, see STPMotorConnections[1A], STPMotorControl_1[3C]), DIR_DRV2 (in, see STPMotorConnections[1A], STPMotorControl_1[3C]), ENABLE_DRV1 (in, see STPMotorConnections[1B]), ENABLE_DRV2 (in, see STPMotorConnections[1A]), NFAULT_DRV1 (out, see STPMotorConnections[2B], STPMotorControl_1[1B]), NFAULT_DRV2 (out, see STPMotorConnections[2B], STPMotorControl_1[1B]), NHOME_DRV1 (out, see STPMotorConnections[2B], STPMotorControl_1[2D]), NHOME_DRV2 (out, see STPMotorConnections[2B], STPMotorControl_1[2D]), SPI2_MISO (see STPMotorConnections[1B], STPMotorControl5_1[4C], STPMotorControl6_1[4C], STPMotorControl_1[3C]), SPI2_MOSI (in, see STPMotorConnections[1B], STPMotorControl5_1[4C], STPMotorControl6_1[4C], STPMotorControl_1[3B]), SPI2_NSS_DRV1 (in, see STPMotorConnections[2B], STPMotorControl_1[3A]), SPI2_NSS_DRV2 (in, see STPMotorConnections[2B], STPMotorControl_1[3A]), SPI2_SCK (in, see STPMotorConnections[1B], STPMotorControl5_1[4C], STPMotorControl6_1[4C], STPMotorControl_1[3B]), TIM2_CH1_STEP (in, see STPMotorConnections[1A], STPMotorControl_1[3B]), TIM5_CH1_STEP (in, see STPMotorConnections[1A], STPMotorControl_1[3A])

### Nets
+3V3: C36.2 C38.2 IC3.25(VCC) IC3.42(NSLEEP) IC4.25(VCC) IC4.42(NSLEEP) R12.1 R13.1 R14.1 R15.1 R16.1 R17.1 VR2.1(TOP) VR3.1(TOP)
+48V: F1.2 F2.2
GND: C27.1 C28.1 C29.1 C32.1 C33.1 C34.1 C35.1 C36.1 C37.1 C38.1 IC3.3(PGNDA_1) IC3.10(PGNDA_2) IC3.13(PGNDB_1) IC3.20(PGNDB_2) IC3.22(GND_1) IC3.23(GND_2) IC3.45(EP) IC4.3(PGNDA_1) IC4.10(PGNDA_2) IC4.13(PGNDB_1) IC4.20(PGNDB_2) IC4.22(GND_1) IC4.23(GND_2) IC4.45(EP) VR2.2(BOT) VR3.2(BOT)
AOUT1_DRV1: IC4.4(AOUT1_1) IC4.5(AOUT1_2) IC4.6(AOUT1_3) ; port AOUT1_DRV1
AOUT1_DRV2: IC3.4(AOUT1_1) IC3.5(AOUT1_2) IC3.6(AOUT1_3) ; port AOUT1_DRV2
AOUT2_DRV1: IC4.7(AOUT2_1) IC4.8(AOUT2_2) IC4.9(AOUT2_3) ; port AOUT2_DRV1
AOUT2_DRV2: IC3.7(AOUT2_1) IC3.8(AOUT2_2) IC3.9(AOUT2_3) ; port AOUT2_DRV2
BOUT1_DRV1: IC4.14(BOUT2_1) IC4.15(BOUT2_2) IC4.16(BOUT2_3) ; port BOUT1_DRV1
BOUT1_DRV2: IC3.14(BOUT2_1) IC3.15(BOUT2_2) IC3.16(BOUT2_3) ; port BOUT1_DRV2
BOUT2_DRV1: IC4.17(BOUT1_1) IC4.18(BOUT1_2) IC4.19(BOUT1_3) ; port BOUT2_DRV1
BOUT2_DRV2: IC3.17(BOUT1_1) IC3.18(BOUT1_2) IC3.19(BOUT1_3) ; port BOUT2_DRV2
DIR_DRV1: IC4.40(DIR) ; port DIR_DRV1
DIR_DRV2: IC3.40(DIR) ; port DIR_DRV2
ENABLE_DRV_ALL: IC3.41(ENABLE) IC4.41(ENABLE) ; port ENABLE_DRV1, port ENABLE_DRV2
NFAULT_DRV1: IC4.26(NFAULT) R15.2 ; port NFAULT_DRV1
NFAULT_DRV2: IC3.26(NFAULT) R12.2 ; port NFAULT_DRV2
NHOME_DRV1: IC4.27(NHOME) R16.2 ; port NHOME_DRV1
NHOME_DRV2: IC3.27(NHOME) R13.2 ; port NHOME_DRV2
SPI2_MISO: IC3.36(SDO/DECAY1) IC4.36(SDO/DECAY1) ; port SPI2_MISO
SPI2_MOSI: IC3.37(SDI/DECAY0) IC4.37(SDI/DECAY0) ; port SPI2_MOSI
SPI2_NSS_DRV1: IC4.34(NSCS/M0) ; port SPI2_NSS_DRV1
SPI2_NSS_DRV2: IC3.34(NSCS/M0) ; port SPI2_NSS_DRV2
SPI2_SCK: IC3.38(SCLK/M1) IC4.38(SCLK/M1) ; port SPI2_SCK
TIM2_CH1_STEP: IC4.39(STEP) ; port TIM2_CH1_STEP
TIM5_CH1_STEP: IC3.39(STEP) ; port TIM5_CH1_STEP
Vref_DRV1: IC4.33(VREF) VR3.W(TAP)
Vref_DRV2: IC3.33(VREF) VR2.W(TAP)
NetC25_1: C25.1 C27.2 C28.2 C29.2 F1.1 IC3.2(VM_1) IC3.11(VM_2) IC3.12(VM_3) IC3.21(VM_4)
NetC25_2: C25.2 IC3.1(VCP)
NetC26_1: C26.1 IC3.44(CPH)
NetC26_2: C26.2 IC3.43(CPL)
NetC30_1: C30.1 C33.2 C34.2 C35.2 F2.1 IC4.2(VM_1) IC4.11(VM_2) IC4.12(VM_3) IC4.21(VM_4)
NetC30_2: C30.2 IC4.1(VCP)
NetC31_1: C31.1 IC4.44(CPH)
NetC31_2: C31.2 IC4.43(CPL)
NetC32_2: C32.2 IC3.24(DVDD)
NetC37_2: C37.2 IC4.24(DVDD)
NetIC3_28: IC3.28(MODE) R14.2
NetIC4_28: IC4.28(MODE) R17.2

Not connected (* = marked no-connect by the designer): IC3 29(RSVD_1)* 30(RSVD_2)* 31(RSVD_3)* 32(RSVD_4)* 35(RSVD/TOFF)*; IC4 29(RSVD_1)* 30(RSVD_2)* 31(RSVD_3)* 32(RSVD_4)* 35(RSVD/TOFF)*

### Notes on the sheet
- STEPPER DRIVER2
- Vref is approx 1V, so that teh curernt is limited around 1.5A as per the formula.
  Ifs = Vref/Kv * TRQ_DAC scaler
  since I hardwired the Vref pin, SPI should not set the current limit again, so this should be the setting:
  VREF_INT_EN = 0, do not write (=1), because it will use the internal refernce therefore ingonoring the current limit set externally
  TRQ_DAC     = 0xFF(100%)
- STEPPER DRIVER1
- Vref = 1V
  so with 30k POT
  3.3(9.1/(9.1+20.9)) = 1.001
  1.001/0.66 = 1.51A
- Gimbal Warning Projector Controller
- 5
- 5/8
- Mohamed Hanan

### Library data of the parts
C25 C27-C30 C32-C35 C37 = CAPN 0805: Non Polarized Capacitor, SMD, 0805
C26 C31 C36 C38 = CAPN 1206: Non Polarized Capacitor, SMD, 1206
F1 F2 = 1206L035/16YR: Fuse, PTC Reset, 350mA Hold, 750mA Tripping, 16v; Supplier 1: Element14; Supplier Part Number 1: 1822203
IC3 IC4 = DRV8462DDWR: Integrated Circuit; Manufacturer_Name: Texas Instruments; Datasheet Link: https://www.ti.com/lit/gpn/drv8462; Height: 1.2mm; Manufacturer_Part_Number: DRV8462DDWR; Mouser Part Number: 595-DRV8462DDWR; Mouser Price/Stock: https://www.mouser.co.uk/ProductDetail/Texas-Instruments/DRV8462DDWR?qs=rQFj71Wb1eVexvYNsDfnvA%3D%3D; Arrow Part Number: DRV8462DDWR; Arrow Price/Stock: https://www.arrow.com/en/products/drv8462ddwr/texas-instruments?utm_currency=USD&region=nac
R12-R17 = Resistor 0805: Resistor, SMD, 0805
VR2 VR3 = 3362S-1-202LF: as VR1 on sheet STPMotorControl3_1; Supplier 1: Farnell; Supplier Part Number 1: 2321842

## Sheet STPMotorControl5_1.SchDoc
size A4; SheetNumber: 6; SheetTotal: 8
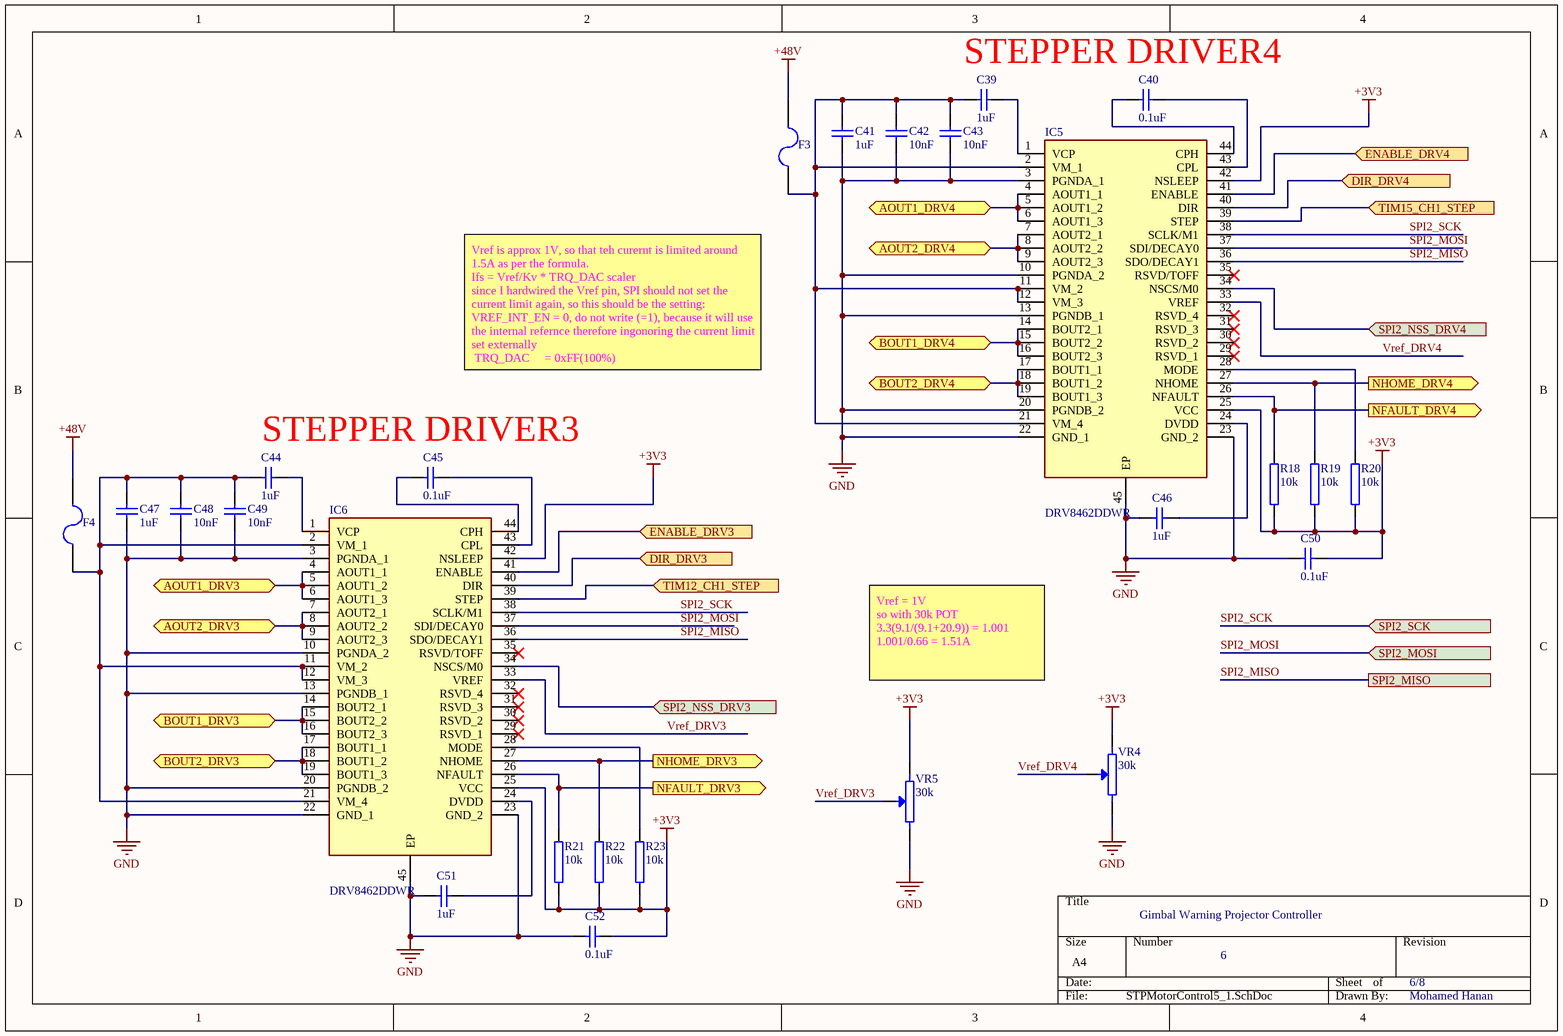
[diagram p5: STPMotorControl5_1.SchDoc]

### Parts
C39  1uF  [CAP_0805]
C40  0.1uF  [CAP_1206]
C41  1uF  [CAP_0805]
C42  10nF  [CAP_0805]
C43  10nF  [CAP_0805]
C44  1uF  [CAP_0805]
C45  0.1uF  [CAP_1206]
C46  1uF  [CAP_0805]
C47  1uF  [CAP_0805]
C48  10nF  [CAP_0805]
C49  10nF  [CAP_0805]
C50  0.1uF  [CAP_1206]
C51  1uF  [CAP_0805]
C52  0.1uF  [CAP_1206]
F3  1206L035/16YR  [MC36207]  (value not drawn)
F4  1206L035/16YR  [MC36207]  (value not drawn)
IC5  DRV8462DDWR  [SOP64P810X120-45N]
IC6  DRV8462DDWR  [SOP64P810X120-45N]
R18  10k  [RES_0805]
R19  10k  [RES_0805]
R20  10k  [RES_0805]
R21  10k  [RES_0805]
R22  10k  [RES_0805]
R23  10k  [RES_0805]
VR4  30k  [3362S]
VR5  30k  [3362S]

### Ports
AOUT1_DRV3 (bidir, see STPMotorConnections[2B], STPMotorControl7_1[1B]), AOUT1_DRV4 (bidir, see STPMotorConnections[2B], STPMotorControl7_1[1C]), AOUT2_DRV3 (bidir, see STPMotorConnections[2B], STPMotorControl7_1[1B]), AOUT2_DRV4 (bidir, see STPMotorConnections[2B], STPMotorControl7_1[1C]), BOUT1_DRV3 (bidir, see STPMotorConnections[2B], STPMotorControl7_1[1B]), BOUT1_DRV4 (bidir, see STPMotorConnections[2C], STPMotorControl7_1[1C]), BOUT2_DRV3 (bidir, see STPMotorConnections[2B], STPMotorControl7_1[1B]), BOUT2_DRV4 (bidir, see STPMotorConnections[2C], STPMotorControl7_1[1C]), DIR_DRV3 (in, see STPMotorConnections[1B], STPMotorControl_1[3D]), DIR_DRV4 (in, see STPMotorConnections[1C], STPMotorControl_1[3D]), ENABLE_DRV3 (in, see STPMotorConnections[1C]), ENABLE_DRV4 (in, see STPMotorConnections[1C]), NFAULT_DRV3 (out, see STPMotorConnections[2C], STPMotorControl_1[1B]), NFAULT_DRV4 (out, see STPMotorConnections[2C], STPMotorControl_1[1B]), NHOME_DRV3 (out, see STPMotorConnections[2C], STPMotorControl_1[2D]), NHOME_DRV4 (out, see STPMotorConnections[2C], STPMotorControl_1[2D]), SPI2_MISO (see STPMotorConnections[1C], STPMotorControl4_1[4C], STPMotorControl6_1[4C], STPMotorControl_1[3C]), SPI2_MOSI (in, see STPMotorConnections[1C], STPMotorControl4_1[4C], STPMotorControl6_1[4C], STPMotorControl_1[3B]), SPI2_NSS_DRV3 (in, see STPMotorConnections[2C], STPMotorControl_1[3A]), SPI2_NSS_DRV4 (in, see STPMotorConnections[2C], STPMotorControl_1[3A]), SPI2_SCK (in, see STPMotorConnections[1C], STPMotorControl4_1[4C], STPMotorControl6_1[4C], STPMotorControl_1[3B]), TIM12_CH1_STEP (in, see STPMotorConnections[1B], STPMotorControl_1[3C]), TIM15_CH1_STEP (in, see STPMotorConnections[1B], STPMotorControl_1[3A])

### Nets
+3V3: C50.1 C52.1 IC5.25(VCC) IC5.42(NSLEEP) IC6.25(VCC) IC6.42(NSLEEP) R18.1 R19.1 R20.1 R21.1 R22.1 R23.1 VR4.1(TOP) VR5.1(TOP)
+48V: F3.2 F4.2
GND: C41.1 C42.1 C43.1 C46.2 C47.1 C48.1 C49.1 C50.2 C51.2 C52.2 IC5.3(PGNDA_1) IC5.10(PGNDA_2) IC5.13(PGNDB_1) IC5.20(PGNDB_2) IC5.22(GND_1) IC5.23(GND_2) IC5.45(EP) IC6.3(PGNDA_1) IC6.10(PGNDA_2) IC6.13(PGNDB_1) IC6.20(PGNDB_2) IC6.22(GND_1) IC6.23(GND_2) IC6.45(EP) VR4.2(BOT) VR5.2(BOT)
AOUT1_DRV3: IC6.4(AOUT1_1) IC6.5(AOUT1_2) IC6.6(AOUT1_3) ; port AOUT1_DRV3
AOUT1_DRV4: IC5.4(AOUT1_1) IC5.5(AOUT1_2) IC5.6(AOUT1_3) ; port AOUT1_DRV4
AOUT2_DRV3: IC6.7(AOUT2_1) IC6.8(AOUT2_2) IC6.9(AOUT2_3) ; port AOUT2_DRV3
AOUT2_DRV4: IC5.7(AOUT2_1) IC5.8(AOUT2_2) IC5.9(AOUT2_3) ; port AOUT2_DRV4
BOUT1_DRV3: IC6.14(BOUT2_1) IC6.15(BOUT2_2) IC6.16(BOUT2_3) ; port BOUT1_DRV3
BOUT1_DRV4: IC5.14(BOUT2_1) IC5.15(BOUT2_2) IC5.16(BOUT2_3) ; port BOUT1_DRV4
BOUT2_DRV3: IC6.17(BOUT1_1) IC6.18(BOUT1_2) IC6.19(BOUT1_3) ; port BOUT2_DRV3
BOUT2_DRV4: IC5.17(BOUT1_1) IC5.18(BOUT1_2) IC5.19(BOUT1_3) ; port BOUT2_DRV4
DIR_DRV3: IC6.40(DIR) ; port DIR_DRV3
DIR_DRV4: IC5.40(DIR) ; port DIR_DRV4
ENABLE_DRV_ALL: IC5.41(ENABLE) IC6.41(ENABLE) ; port ENABLE_DRV3, port ENABLE_DRV4
NFAULT_DRV3: IC6.26(NFAULT) R21.2 ; port NFAULT_DRV3
NFAULT_DRV4: IC5.26(NFAULT) R18.2 ; port NFAULT_DRV4
NHOME_DRV3: IC6.27(NHOME) R22.2 ; port NHOME_DRV3
NHOME_DRV4: IC5.27(NHOME) R19.2 ; port NHOME_DRV4
SPI2_MISO: IC5.36(SDO/DECAY1) IC6.36(SDO/DECAY1) ; port SPI2_MISO
SPI2_MOSI: IC5.37(SDI/DECAY0) IC6.37(SDI/DECAY0) ; port SPI2_MOSI
SPI2_NSS_DRV3: IC6.34(NSCS/M0) ; port SPI2_NSS_DRV3
SPI2_NSS_DRV4: IC5.34(NSCS/M0) ; port SPI2_NSS_DRV4
SPI2_SCK: IC5.38(SCLK/M1) IC6.38(SCLK/M1) ; port SPI2_SCK
TIM12_CH1_STEP: IC6.39(STEP) ; port TIM12_CH1_STEP
TIM15_CH1_STEP: IC5.39(STEP) ; port TIM15_CH1_STEP
Vref_DRV3: IC6.33(VREF) VR5.W(TAP)
Vref_DRV4: IC5.33(VREF) VR4.W(TAP)
NetC39_1: C39.1 IC5.1(VCP)
NetC39_2: C39.2 C41.2 C42.2 C43.2 F3.1 IC5.2(VM_1) IC5.11(VM_2) IC5.12(VM_3) IC5.21(VM_4)
NetC40_1: C40.1 IC5.43(CPL)
NetC40_2: C40.2 IC5.44(CPH)
NetC44_1: C44.1 IC6.1(VCP)
NetC44_2: C44.2 C47.2 C48.2 C49.2 F4.1 IC6.2(VM_1) IC6.11(VM_2) IC6.12(VM_3) IC6.21(VM_4)
NetC45_1: C45.1 IC6.43(CPL)
NetC45_2: C45.2 IC6.44(CPH)
NetC46_1: C46.1 IC5.24(DVDD)
NetC51_1: C51.1 IC6.24(DVDD)
NetIC5_28: IC5.28(MODE) R20.2
NetIC6_28: IC6.28(MODE) R23.2

Not connected (* = marked no-connect by the designer): IC5 29(RSVD_1)* 30(RSVD_2)* 31(RSVD_3)* 32(RSVD_4)* 35(RSVD/TOFF)*; IC6 29(RSVD_1)* 30(RSVD_2)* 31(RSVD_3)* 32(RSVD_4)* 35(RSVD/TOFF)*

### Notes on the sheet
- STEPPER DRIVER4
- Vref is approx 1V, so that teh curernt is limited around 1.5A as per the formula.
  Ifs = Vref/Kv * TRQ_DAC scaler
  since I hardwired the Vref pin, SPI should not set the current limit again, so this should be the setting:
  VREF_INT_EN = 0, do not write (=1), because it will use the internal refernce therefore ingonoring the current limit set externally
  TRQ_DAC     = 0xFF(100%)
- STEPPER DRIVER3
- Vref = 1V
  so with 30k POT
  3.3(9.1/(9.1+20.9)) = 1.001
  1.001/0.66 = 1.51A
- Gimbal Warning Projector Controller
- 6
- 6/8
- Mohamed Hanan

### Library data of the parts
C39 C41-C44 C46-C49 C51 = CAPN 0805: Non Polarized Capacitor, SMD, 0805
C40 C45 C50 C52 = CAPN 1206: Non Polarized Capacitor, SMD, 1206
F3 F4 = 1206L035/16YR: as F1 on sheet STPMotorControl4_1; Supplier 1: Element14; Supplier Part Number 1: 1822203
IC5 IC6 = DRV8462DDWR: as IC3 on sheet STPMotorControl4_1; Datasheet Link: https://www.ti.com/lit/gpn/drv8462; Height: 1.2mm; Manufacturer_Part_Number: DRV8462DDWR; Mouser Part Number: 595-DRV8462DDWR; Mouser Price/Stock: https://www.mouser.co.uk/ProductDetail/Texas-Instruments/DRV8462DDWR?qs=rQFj71Wb1eVexvYNsDfnvA%3D%3D; Arrow Part Number: DRV8462DDWR; Arrow Price/Stock: https://www.arrow.com/en/products/drv8462ddwr/texas-instruments?utm_currency=USD&region=nac
R18-R23 = Resistor 0805: Resistor, SMD, 0805
VR4 VR5 = 3362S-1-202LF: as VR1 on sheet STPMotorControl3_1; Supplier 1: Farnell; Supplier Part Number 1: 2321842

## Sheet STPMotorControl6_1.SchDoc
size A4; SheetNumber: 7; SheetTotal: 8
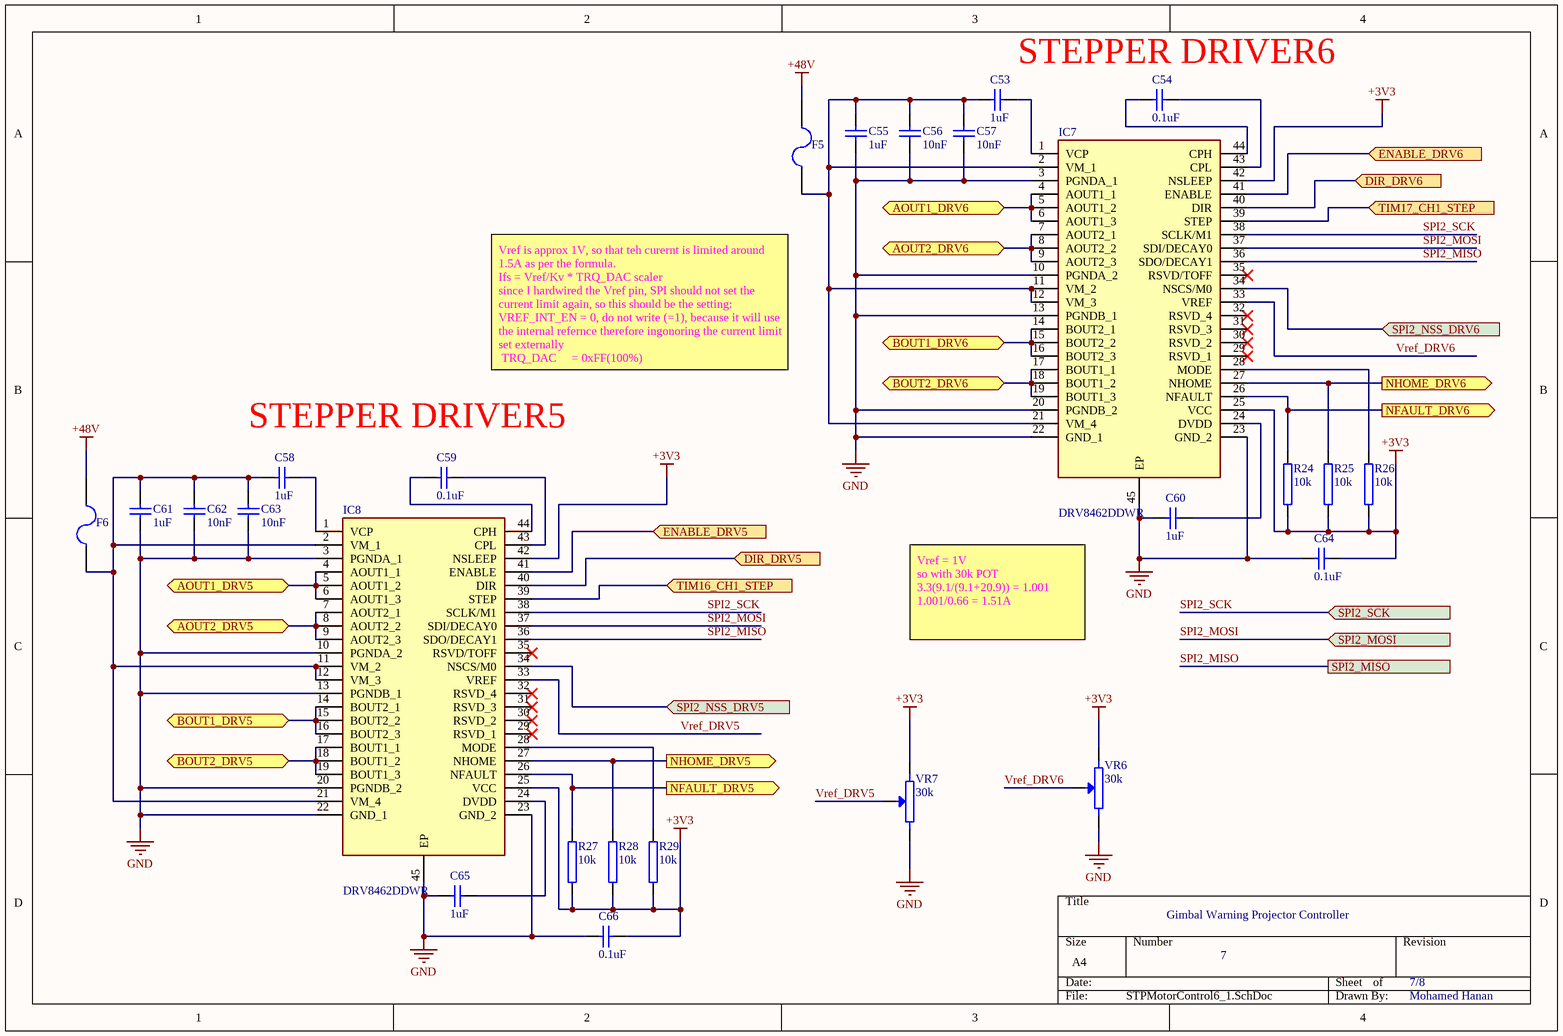
[diagram p6: STPMotorControl6_1.SchDoc]

### Parts
C53  1uF  [CAP_0805]
C54  0.1uF  [CAP_1206]
C55  1uF  [CAP_0805]
C56  10nF  [CAP_0805]
C57  10nF  [CAP_0805]
C58  1uF  [CAP_0805]
C59  0.1uF  [CAP_1206]
C60  1uF  [CAP_0805]
C61  1uF  [CAP_0805]
C62  10nF  [CAP_0805]
C63  10nF  [CAP_0805]
C64  0.1uF  [CAP_1206]
C65  1uF  [CAP_0805]
C66  0.1uF  [CAP_1206]
F5  1206L035/16YR  [MC36207]  (value not drawn)
F6  1206L035/16YR  [MC36207]  (value not drawn)
IC7  DRV8462DDWR  [SOP64P810X120-45N]
IC8  DRV8462DDWR  [SOP64P810X120-45N]
R24  10k  [RES_0805]
R25  10k  [RES_0805]
R26  10k  [RES_0805]
R27  10k  [RES_0805]
R28  10k  [RES_0805]
R29  10k  [RES_0805]
VR6  30k  [3362S]
VR7  30k  [3362S]

### Ports
AOUT1_DRV5 (bidir, see STPMotorConnections[2C], STPMotorControl7_1[1C]), AOUT1_DRV6 (bidir, see STPMotorConnections[2D], STPMotorControl7_1[1D]), AOUT2_DRV5 (bidir, see STPMotorConnections[2C], STPMotorControl7_1[1C]), AOUT2_DRV6 (bidir, see STPMotorConnections[2D], STPMotorControl7_1[1D]), BOUT1_DRV5 (bidir, see STPMotorConnections[2C], STPMotorControl7_1[1C]), BOUT1_DRV6 (bidir, see STPMotorConnections[2D], STPMotorControl7_1[1D]), BOUT2_DRV5 (bidir, see STPMotorConnections[2D], STPMotorControl7_1[1C]), BOUT2_DRV6 (bidir, see STPMotorConnections[2D], STPMotorControl7_1[1D]), DIR_DRV5 (in, see STPMotorConnections[1D], STPMotorControl_1[3D]), DIR_DRV6 (in, see STPMotorConnections[1D], STPMotorControl_1[3D]), ENABLE_DRV5 (in, see STPMotorConnections[1D]), ENABLE_DRV6 (in, see STPMotorConnections[1D]), NFAULT_DRV5 (out, see STPMotorConnections[2D], STPMotorControl_1[1B]), NFAULT_DRV6 (out, see STPMotorConnections[2D], STPMotorControl_1[1C]), NHOME_DRV5 (out, see STPMotorConnections[2D], STPMotorControl_1[1C]), NHOME_DRV6 (out, see STPMotorConnections[2D], STPMotorControl_1[1C]), SPI2_MISO (see STPMotorConnections[1D], STPMotorControl4_1[4C], STPMotorControl5_1[4C], STPMotorControl_1[3C]), SPI2_MOSI (in, see STPMotorConnections[1D], STPMotorControl4_1[4C], STPMotorControl5_1[4C], STPMotorControl_1[3B]), SPI2_NSS_DRV5 (in, see STPMotorConnections[2D], STPMotorControl_1[3A]), SPI2_NSS_DRV6 (in, see STPMotorConnections[2D], STPMotorControl_1[3C]), SPI2_SCK (in, see STPMotorConnections[1D], STPMotorControl4_1[4C], STPMotorControl5_1[4C], STPMotorControl_1[3B]), TIM16_CH1_STEP (in, see STPMotorConnections[1D], STPMotorControl_1[3A]), TIM17_CH1_STEP (in, see STPMotorConnections[1D], STPMotorControl_1[3A])

### Nets
+3V3: C64.1 C66.1 IC7.25(VCC) IC7.42(NSLEEP) IC8.25(VCC) IC8.42(NSLEEP) R24.1 R25.1 R26.1 R27.1 R28.1 R29.1 VR6.1(TOP) VR7.1(TOP)
+48V: F5.2 F6.2
GND: C55.1 C56.1 C57.1 C60.2 C61.1 C62.1 C63.1 C64.2 C65.2 C66.2 IC7.3(PGNDA_1) IC7.10(PGNDA_2) IC7.13(PGNDB_1) IC7.20(PGNDB_2) IC7.22(GND_1) IC7.23(GND_2) IC7.45(EP) IC8.3(PGNDA_1) IC8.10(PGNDA_2) IC8.13(PGNDB_1) IC8.20(PGNDB_2) IC8.22(GND_1) IC8.23(GND_2) IC8.45(EP) VR6.2(BOT) VR7.2(BOT)
AOUT1_DRV5: IC8.4(AOUT1_1) IC8.5(AOUT1_2) IC8.6(AOUT1_3) ; port AOUT1_DRV5
AOUT1_DRV6: IC7.4(AOUT1_1) IC7.5(AOUT1_2) IC7.6(AOUT1_3) ; port AOUT1_DRV6
AOUT2_DRV5: IC8.7(AOUT2_1) IC8.8(AOUT2_2) IC8.9(AOUT2_3) ; port AOUT2_DRV5
AOUT2_DRV6: IC7.7(AOUT2_1) IC7.8(AOUT2_2) IC7.9(AOUT2_3) ; port AOUT2_DRV6
BOUT1_DRV5: IC8.14(BOUT2_1) IC8.15(BOUT2_2) IC8.16(BOUT2_3) ; port BOUT1_DRV5
BOUT1_DRV6: IC7.14(BOUT2_1) IC7.15(BOUT2_2) IC7.16(BOUT2_3) ; port BOUT1_DRV6
BOUT2_DRV5: IC8.17(BOUT1_1) IC8.18(BOUT1_2) IC8.19(BOUT1_3) ; port BOUT2_DRV5
BOUT2_DRV6: IC7.17(BOUT1_1) IC7.18(BOUT1_2) IC7.19(BOUT1_3) ; port BOUT2_DRV6
DIR_DRV5: IC8.40(DIR) ; port DIR_DRV5
DIR_DRV6: IC7.40(DIR) ; port DIR_DRV6
ENABLE_DRV_ALL: IC7.41(ENABLE) IC8.41(ENABLE) ; port ENABLE_DRV5, port ENABLE_DRV6
NFAULT_DRV5: IC8.26(NFAULT) R27.2 ; port NFAULT_DRV5
NFAULT_DRV6: IC7.26(NFAULT) R24.2 ; port NFAULT_DRV6
NHOME_DRV5: IC8.27(NHOME) R28.2 ; port NHOME_DRV5
NHOME_DRV6: IC7.27(NHOME) R25.2 ; port NHOME_DRV6
SPI2_MISO: IC7.36(SDO/DECAY1) IC8.36(SDO/DECAY1) ; port SPI2_MISO
SPI2_MOSI: IC7.37(SDI/DECAY0) IC8.37(SDI/DECAY0) ; port SPI2_MOSI
SPI2_NSS_DRV5: IC8.34(NSCS/M0) ; port SPI2_NSS_DRV5
SPI2_NSS_DRV6: IC7.34(NSCS/M0) ; port SPI2_NSS_DRV6
SPI2_SCK: IC7.38(SCLK/M1) IC8.38(SCLK/M1) ; port SPI2_SCK
TIM16_CH1_STEP: IC8.39(STEP) ; port TIM16_CH1_STEP
TIM17_CH1_STEP: IC7.39(STEP) ; port TIM17_CH1_STEP
Vref_DRV5: IC8.33(VREF) VR7.W(TAP)
Vref_DRV6: IC7.33(VREF) VR6.W(TAP)
NetC53_1: C53.1 IC7.1(VCP)
NetC53_2: C53.2 C55.2 C56.2 C57.2 F5.1 IC7.2(VM_1) IC7.11(VM_2) IC7.12(VM_3) IC7.21(VM_4)
NetC54_1: C54.1 IC7.43(CPL)
NetC54_2: C54.2 IC7.44(CPH)
NetC58_1: C58.1 IC8.1(VCP)
NetC58_2: C58.2 C61.2 C62.2 C63.2 F6.1 IC8.2(VM_1) IC8.11(VM_2) IC8.12(VM_3) IC8.21(VM_4)
NetC59_1: C59.1 IC8.43(CPL)
NetC59_2: C59.2 IC8.44(CPH)
NetC60_1: C60.1 IC7.24(DVDD)
NetC65_1: C65.1 IC8.24(DVDD)
NetIC7_28: IC7.28(MODE) R26.2
NetIC8_28: IC8.28(MODE) R29.2

Not connected (* = marked no-connect by the designer): IC7 29(RSVD_1)* 30(RSVD_2)* 31(RSVD_3)* 32(RSVD_4)* 35(RSVD/TOFF)*; IC8 29(RSVD_1)* 30(RSVD_2)* 31(RSVD_3)* 32(RSVD_4)* 35(RSVD/TOFF)*

### Notes on the sheet
- STEPPER DRIVER6
- Vref is approx 1V, so that teh curernt is limited around 1.5A as per the formula.
  Ifs = Vref/Kv * TRQ_DAC scaler
  since I hardwired the Vref pin, SPI should not set the current limit again, so this should be the setting:
  VREF_INT_EN = 0, do not write (=1), because it will use the internal refernce therefore ingonoring the current limit set externally
  TRQ_DAC     = 0xFF(100%)
- STEPPER DRIVER5
- Vref = 1V
  so with 30k POT
  3.3(9.1/(9.1+20.9)) = 1.001
  1.001/0.66 = 1.51A
- Gimbal Warning Projector Controller
- 7
- 7/8
- Mohamed Hanan

### Library data of the parts
C53 C55-C58 C60-C63 C65 = CAPN 0805: Non Polarized Capacitor, SMD, 0805
C54 C59 C64 C66 = CAPN 1206: Non Polarized Capacitor, SMD, 1206
F5 F6 = 1206L035/16YR: as F1 on sheet STPMotorControl4_1; Supplier 1: Element14; Supplier Part Number 1: 1822203
IC7 IC8 = DRV8462DDWR: as IC3 on sheet STPMotorControl4_1; Datasheet Link: https://www.ti.com/lit/gpn/drv8462; Height: 1.2mm; Manufacturer_Part_Number: DRV8462DDWR; Mouser Part Number: 595-DRV8462DDWR; Mouser Price/Stock: https://www.mouser.co.uk/ProductDetail/Texas-Instruments/DRV8462DDWR?qs=rQFj71Wb1eVexvYNsDfnvA%3D%3D; Arrow Part Number: DRV8462DDWR; Arrow Price/Stock: https://www.arrow.com/en/products/drv8462ddwr/texas-instruments?utm_currency=USD&region=nac
R24-R29 = Resistor 0805: Resistor, SMD, 0805
VR6 VR7 = 3362S-1-202LF: as VR1 on sheet STPMotorControl3_1; Supplier 1: Farnell; Supplier Part Number 1: 2321842

## Sheet STPMotorControl7_1.SchDoc
size A4; SheetNumber: 8; SheetTotal: 8
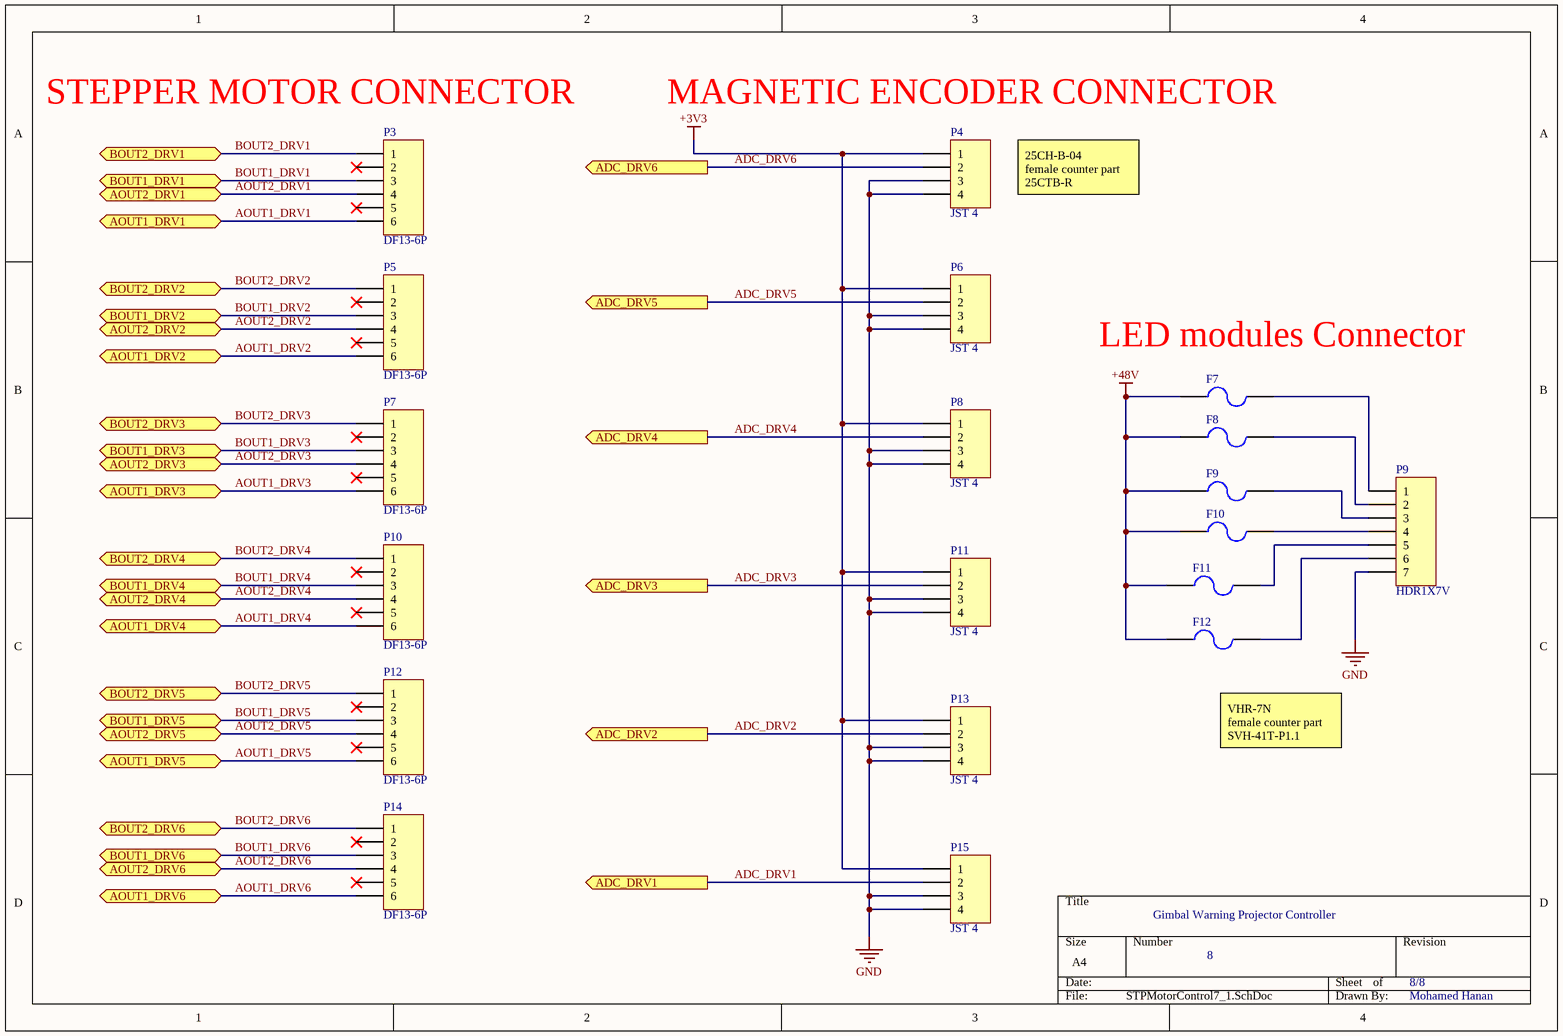
[diagram p7: STPMotorControl7_1.SchDoc]

### Parts
F7  1206L035/16YR  [MC36207]  (value not drawn)
F8  1206L035/16YR  [MC36207]  (value not drawn)
F9  1206L035/16YR  [MC36207]  (value not drawn)
F10  1206L035/16YR  [MC36207]  (value not drawn)
F11  1206L035/16YR  [MC36207]  (value not drawn)
F12  1206L035/16YR  [MC36207]  (value not drawn)
P3  DF13-6P  [DF13-6]
P4  JST 4  [XA-4]
P5  DF13-6P  [DF13-6]
P6  JST 4  [XA-4]
P7  DF13-6P  [DF13-6]
P8  JST 4  [XA-4]
P9  HDR1X7V  [HDR1X7_AUT]
P10  DF13-6P  [DF13-6]
P11  JST 4  [XA-4]
P12  DF13-6P  [DF13-6]
P13  JST 4  [XA-4]
P14  DF13-6P  [DF13-6]
P15  JST 4  [XA-4]

### Ports
ADC_DRV1 (out, see STPMotorConnections[3C], STPMotorControl_1[1C]), ADC_DRV2 (out, see STPMotorConnections[3C], STPMotorControl_1[1C]), ADC_DRV3 (out, see STPMotorConnections[3C], STPMotorControl_1[1D]), ADC_DRV4 (out, see STPMotorConnections[3C], STPMotorControl_1[1D]), ADC_DRV5 (out, see STPMotorConnections[3C], STPMotorControl_1[1D]), ADC_DRV6 (out, see STPMotorConnections[3C], STPMotorControl_1[1D]), AOUT1_DRV1 (bidir, see STPMotorConnections[3C], STPMotorControl4_1[1C]), AOUT1_DRV2 (bidir, see STPMotorConnections[3C], STPMotorControl4_1[3A]), AOUT1_DRV3 (bidir, see STPMotorConnections[3D], STPMotorControl5_1[1C]), AOUT1_DRV4 (bidir, see STPMotorConnections[4C], STPMotorControl5_1[3A]), AOUT1_DRV5 (bidir, see STPMotorConnections[4C], STPMotorControl6_1[1C]), AOUT1_DRV6 (bidir, see STPMotorConnections[4C], STPMotorControl6_1[3A]), AOUT2_DRV1 (bidir, see STPMotorConnections[3C], STPMotorControl4_1[1C]), AOUT2_DRV2 (bidir, see STPMotorConnections[3C], STPMotorControl4_1[3A]), AOUT2_DRV3 (bidir, see STPMotorConnections[3D], STPMotorControl5_1[1C]), AOUT2_DRV4 (bidir, see STPMotorConnections[4C], STPMotorControl5_1[3A]), AOUT2_DRV5 (bidir, see STPMotorConnections[4C], STPMotorControl6_1[1C]), AOUT2_DRV6 (bidir, see STPMotorConnections[4C], STPMotorControl6_1[3A]), BOUT1_DRV1 (bidir, see STPMotorConnections[3C], STPMotorControl4_1[1C]), BOUT1_DRV2 (bidir, see STPMotorConnections[3C], STPMotorControl4_1[3B]), BOUT1_DRV3 (bidir, see STPMotorConnections[3D], STPMotorControl5_1[1C]), BOUT1_DRV4 (bidir, see STPMotorConnections[4C], STPMotorControl5_1[3B]), BOUT1_DRV5 (bidir, see STPMotorConnections[4C], STPMotorControl6_1[1C]), BOUT1_DRV6 (bidir, see STPMotorConnections[4C], STPMotorControl6_1[3B]), BOUT2_DRV1 (bidir, see STPMotorConnections[3C], STPMotorControl4_1[1C]), BOUT2_DRV2 (bidir, see STPMotorConnections[3C], STPMotorControl4_1[3B]), BOUT2_DRV3 (bidir, see STPMotorConnections[3D], STPMotorControl5_1[1C]), BOUT2_DRV4 (bidir, see STPMotorConnections[4C], STPMotorControl5_1[3B]), BOUT2_DRV5 (bidir, see STPMotorConnections[4C], STPMotorControl6_1[1C]), BOUT2_DRV6 (bidir, see STPMotorConnections[4C], STPMotorControl6_1[3B])

### Nets
+3V3: P4.1 P6.1 P8.1 P11.1 P13.1 P15.1
+48V: F7.1 F8.1 F9.1 F10.1 F11.1 F12.1
GND: P4.3 P4.4 P6.3 P6.4 P8.3 P8.4 P9.7 P11.3 P11.4 P13.3 P13.4 P15.3 P15.4
ADC_DRV1: P15.2 ; port ADC_DRV1
ADC_DRV2: P13.2 ; port ADC_DRV2
ADC_DRV3: P11.2 ; port ADC_DRV3
ADC_DRV4: P8.2 ; port ADC_DRV4
ADC_DRV5: P6.2 ; port ADC_DRV5
ADC_DRV6: P4.2 ; port ADC_DRV6
AOUT1_DRV1: P3.6 ; port AOUT1_DRV1
AOUT1_DRV2: P5.6 ; port AOUT1_DRV2
AOUT1_DRV3: P7.6 ; port AOUT1_DRV3
AOUT1_DRV4: P10.6 ; port AOUT1_DRV4
AOUT1_DRV5: P12.6 ; port AOUT1_DRV5
AOUT1_DRV6: P14.6 ; port AOUT1_DRV6
AOUT2_DRV1: P3.4 ; port AOUT2_DRV1
AOUT2_DRV2: P5.4 ; port AOUT2_DRV2
AOUT2_DRV3: P7.4 ; port AOUT2_DRV3
AOUT2_DRV4: P10.4 ; port AOUT2_DRV4
AOUT2_DRV5: P12.4 ; port AOUT2_DRV5
AOUT2_DRV6: P14.4 ; port AOUT2_DRV6
BOUT1_DRV1: P3.3 ; port BOUT1_DRV1
BOUT1_DRV2: P5.3 ; port BOUT1_DRV2
BOUT1_DRV3: P7.3 ; port BOUT1_DRV3
BOUT1_DRV4: P10.3 ; port BOUT1_DRV4
BOUT1_DRV5: P12.3 ; port BOUT1_DRV5
BOUT1_DRV6: P14.3 ; port BOUT1_DRV6
BOUT2_DRV1: P3.1 ; port BOUT2_DRV1
BOUT2_DRV2: P5.1 ; port BOUT2_DRV2
BOUT2_DRV3: P7.1 ; port BOUT2_DRV3
BOUT2_DRV4: P10.1 ; port BOUT2_DRV4
BOUT2_DRV5: P12.1 ; port BOUT2_DRV5
BOUT2_DRV6: P14.1 ; port BOUT2_DRV6
NetF7_2: F7.2 P9.1
NetF8_2: F8.2 P9.2
NetF9_2: F9.2 P9.3
NetF10_2: F10.2 P9.4
NetF11_2: F11.2 P9.5
NetF12_2: F12.2 P9.6

Not connected (* = marked no-connect by the designer): P3 2* 5*; P5 2* 5*; P7 2* 5*; P10 2* 5*; P12 2* 5*; P14 2* 5*

### Notes on the sheet
- (near P3) STEPPER MOTOR CONNECTOR
- (near P4) MAGNETIC ENCODER CONNECTOR
- 25CH-B-04
  female counter part
  25CTB-R
- (near F7) LED modules Connector
- VHR-7N
  female counter part
  SVH-41T-P1.1
- Gimbal Warning Projector Controller
- 8
- 8/8
- Mohamed Hanan

### Library data of the parts
F7-F12 = 1206L035/16YR: as F1 on sheet STPMotorControl4_1; Supplier 1: Element14; Supplier Part Number 1: 1822203
P3 P5 P7 P10 P12 P14 = DF13-6P: HIROSE(HRS)  DF13-6P-1.25H(20)  Wire-To-Board Connector, Right Angle, DF13 Series, Surface Mount, Header, 6 Contacts, 1.25 mm; Supplier 1: Farnell; Supplier Part Number 1: 1324928
P4 P6 P8 P11 P13 P15 = JST XA Header 4: JST XA Header, 4-Pin, Pitch 2.5mm; Supplier 1: Farnell; Supplier Part Number 1: 9492089
P9 = HDR1X7V: Header, Plug, 2.54mm, 7 Pins, Straight; Supplier 1: Farnell; Supplier Part Number 1: 9731121